# EasyEDA Pro project 省赛8通道电压.epro

# Schematic Schematic1

## Sheets
1 P1: Board Name: Board1; Create Date: 2025-04-08; Page Name: P1; Project Name: SCT2450_8CH; Schematic Name: Schematic1; Update Date: 2025-04-08; Company: 嘉立创EDA; Page Size: A4; Version: V1.0
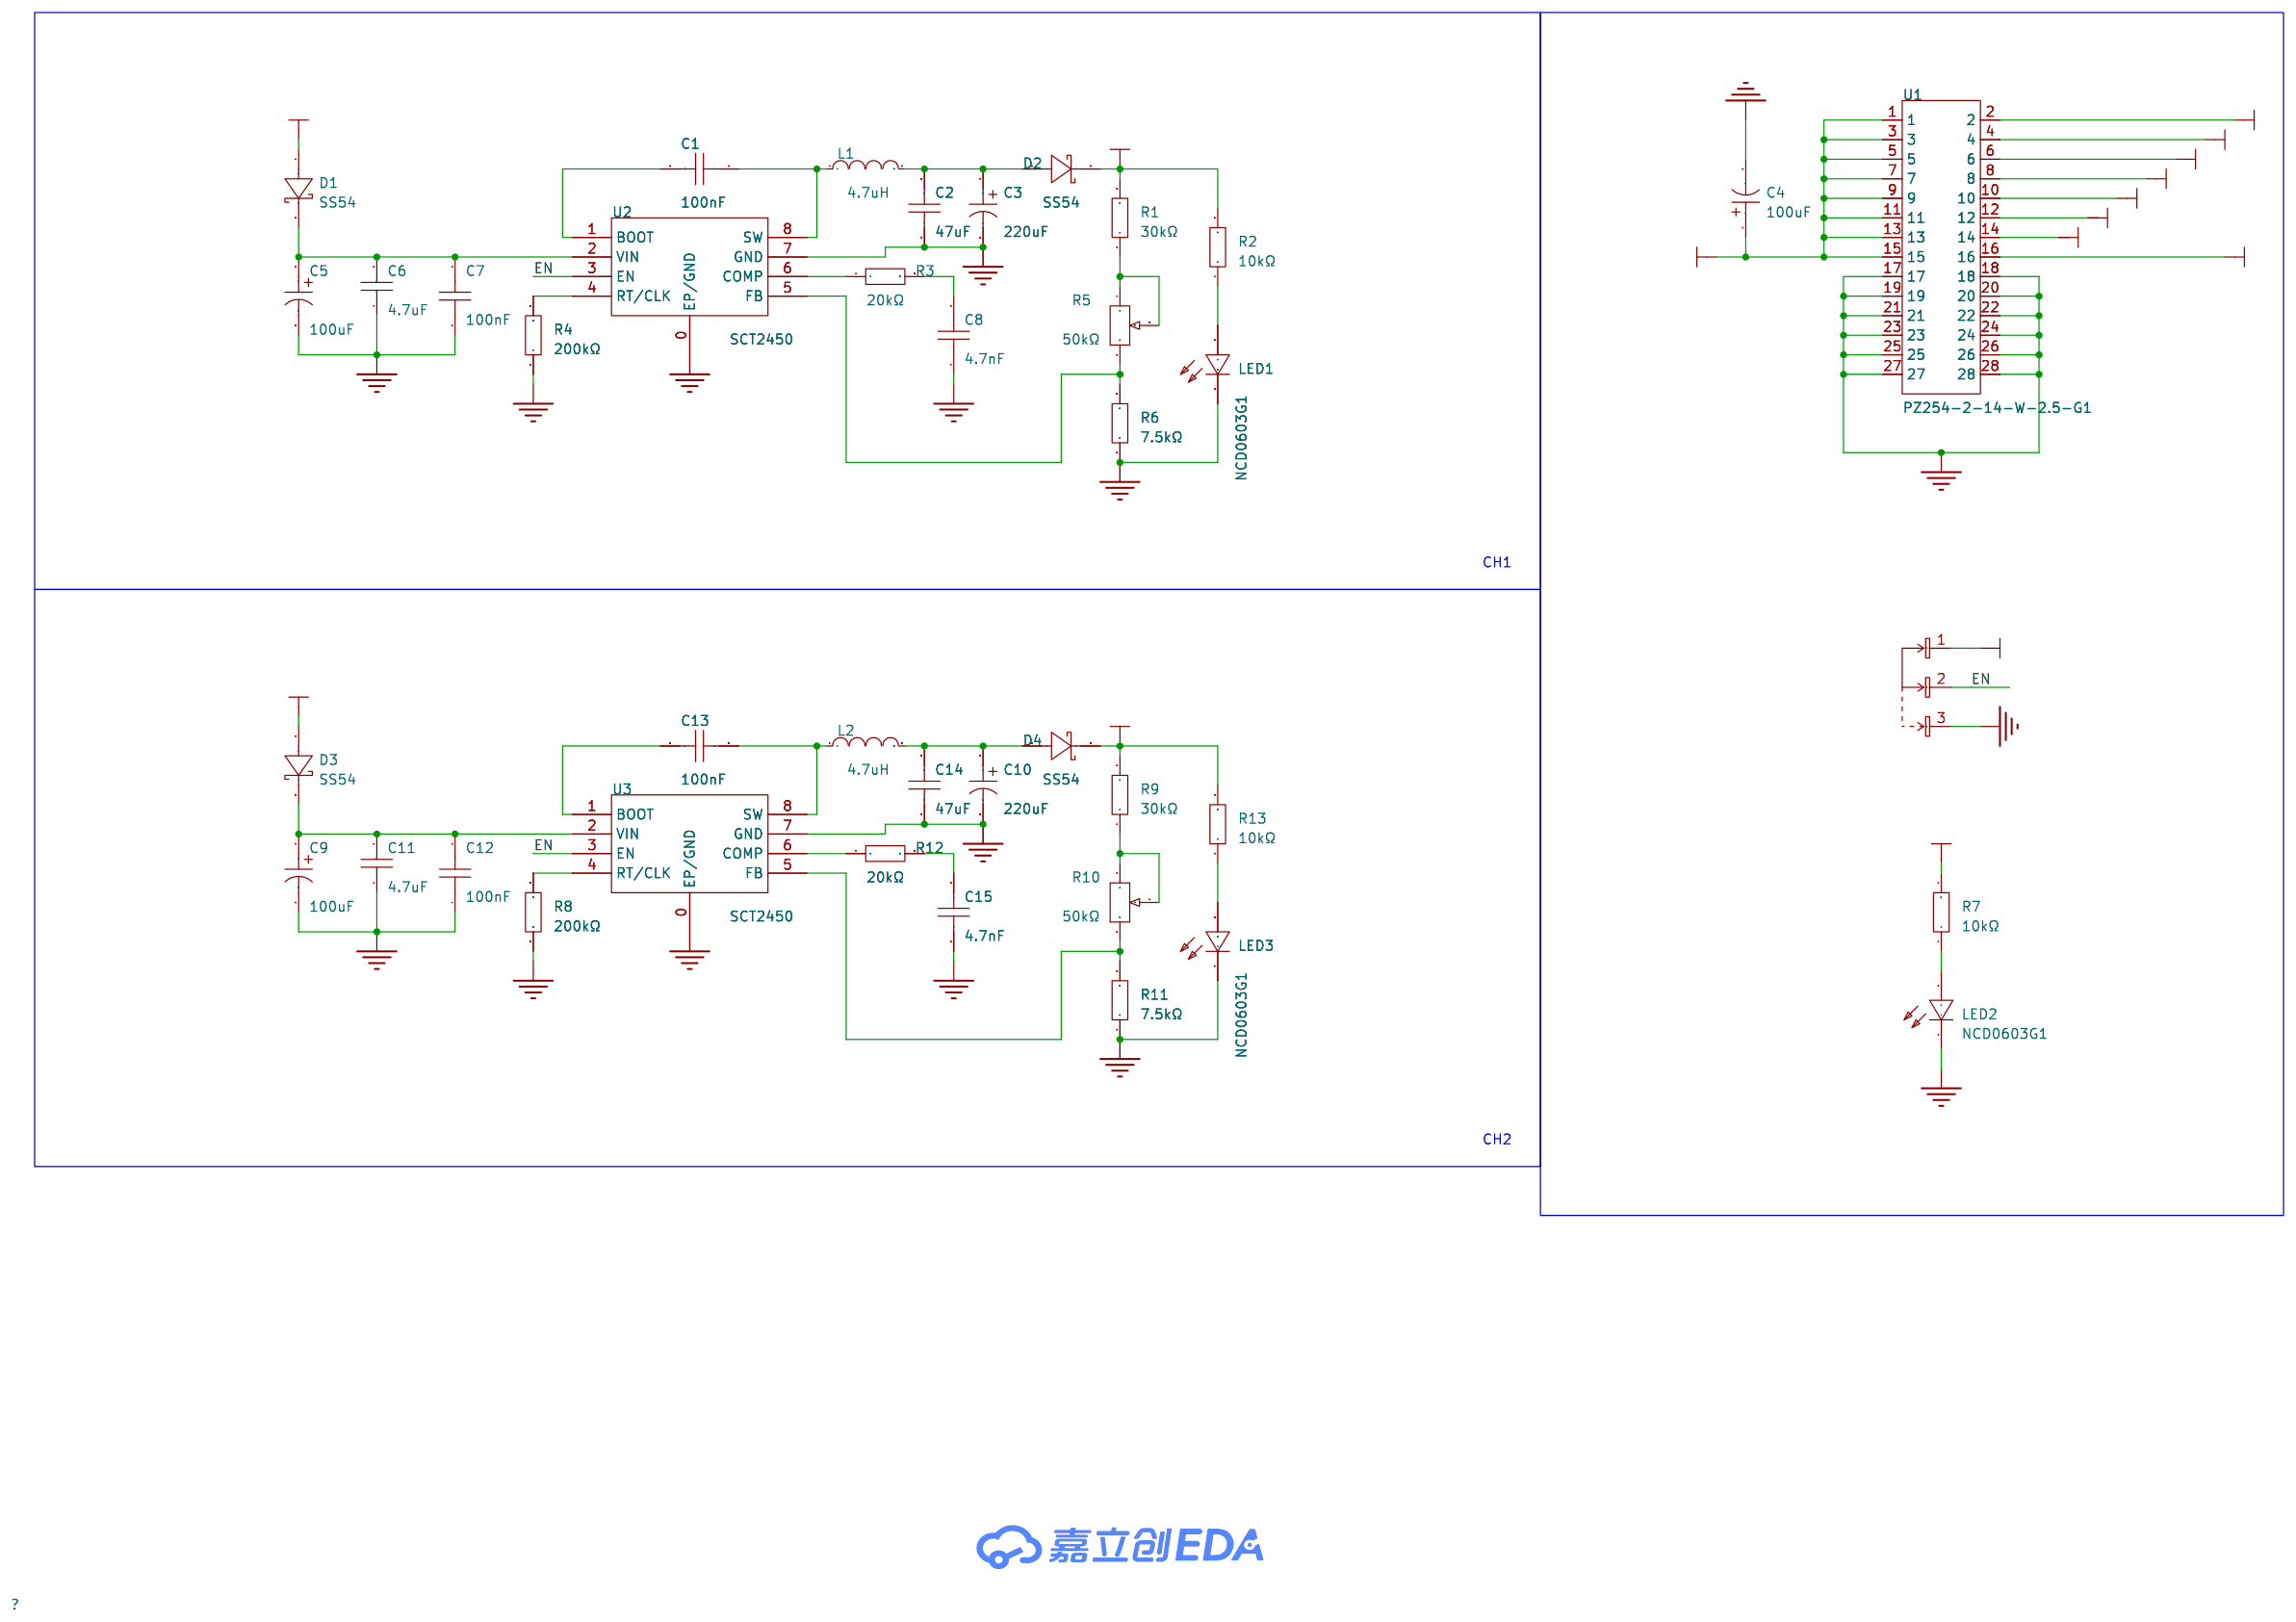
[diagram p0: P1]
2 P2: Page Name: P2
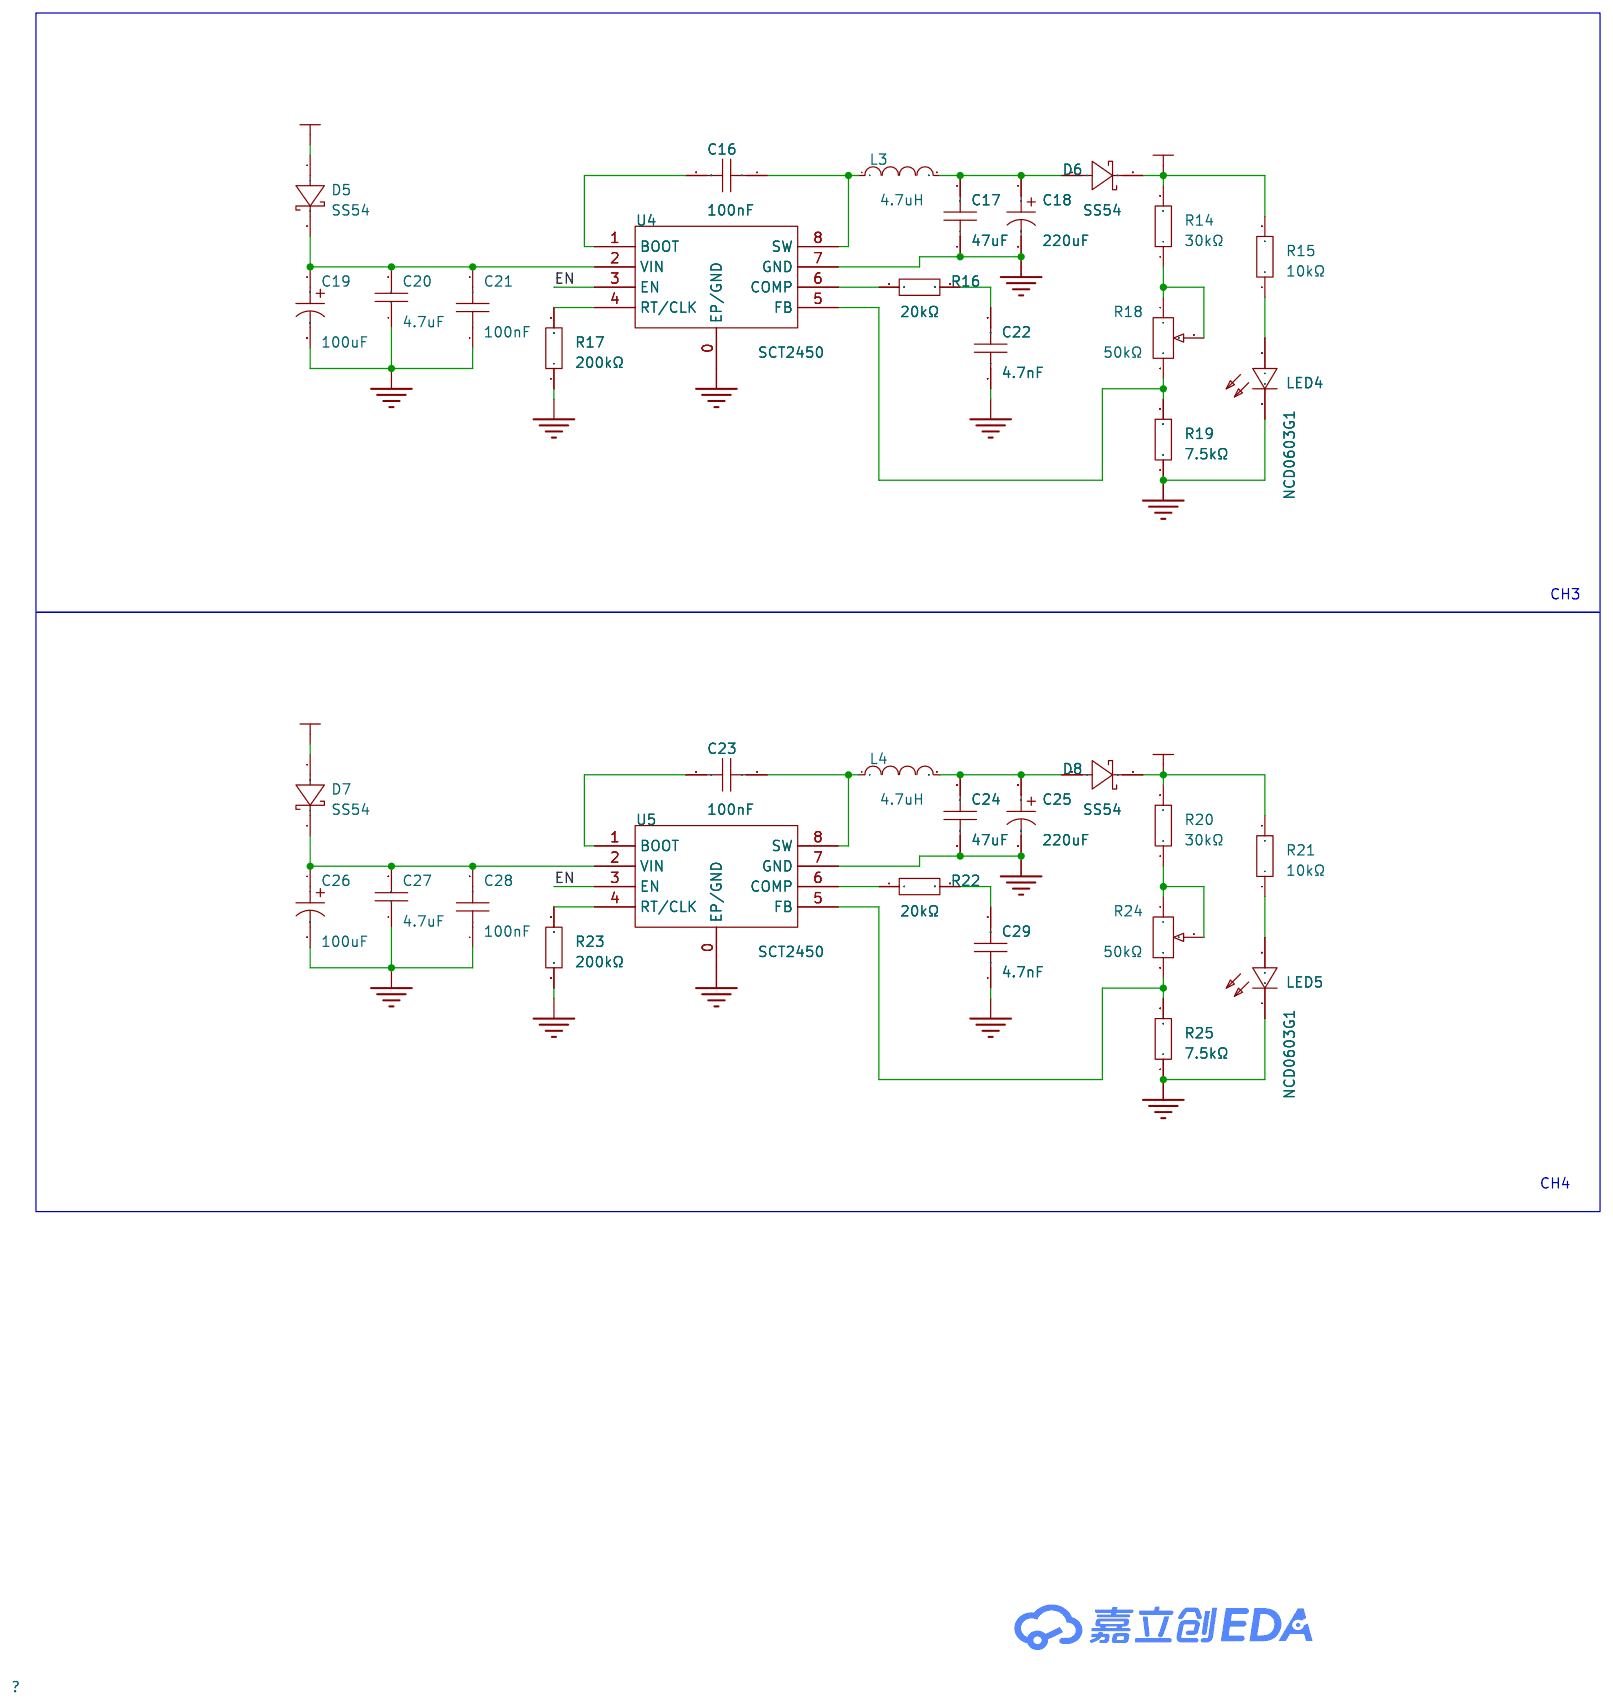
[diagram p1: P2]
3 P3: Page Name: P3
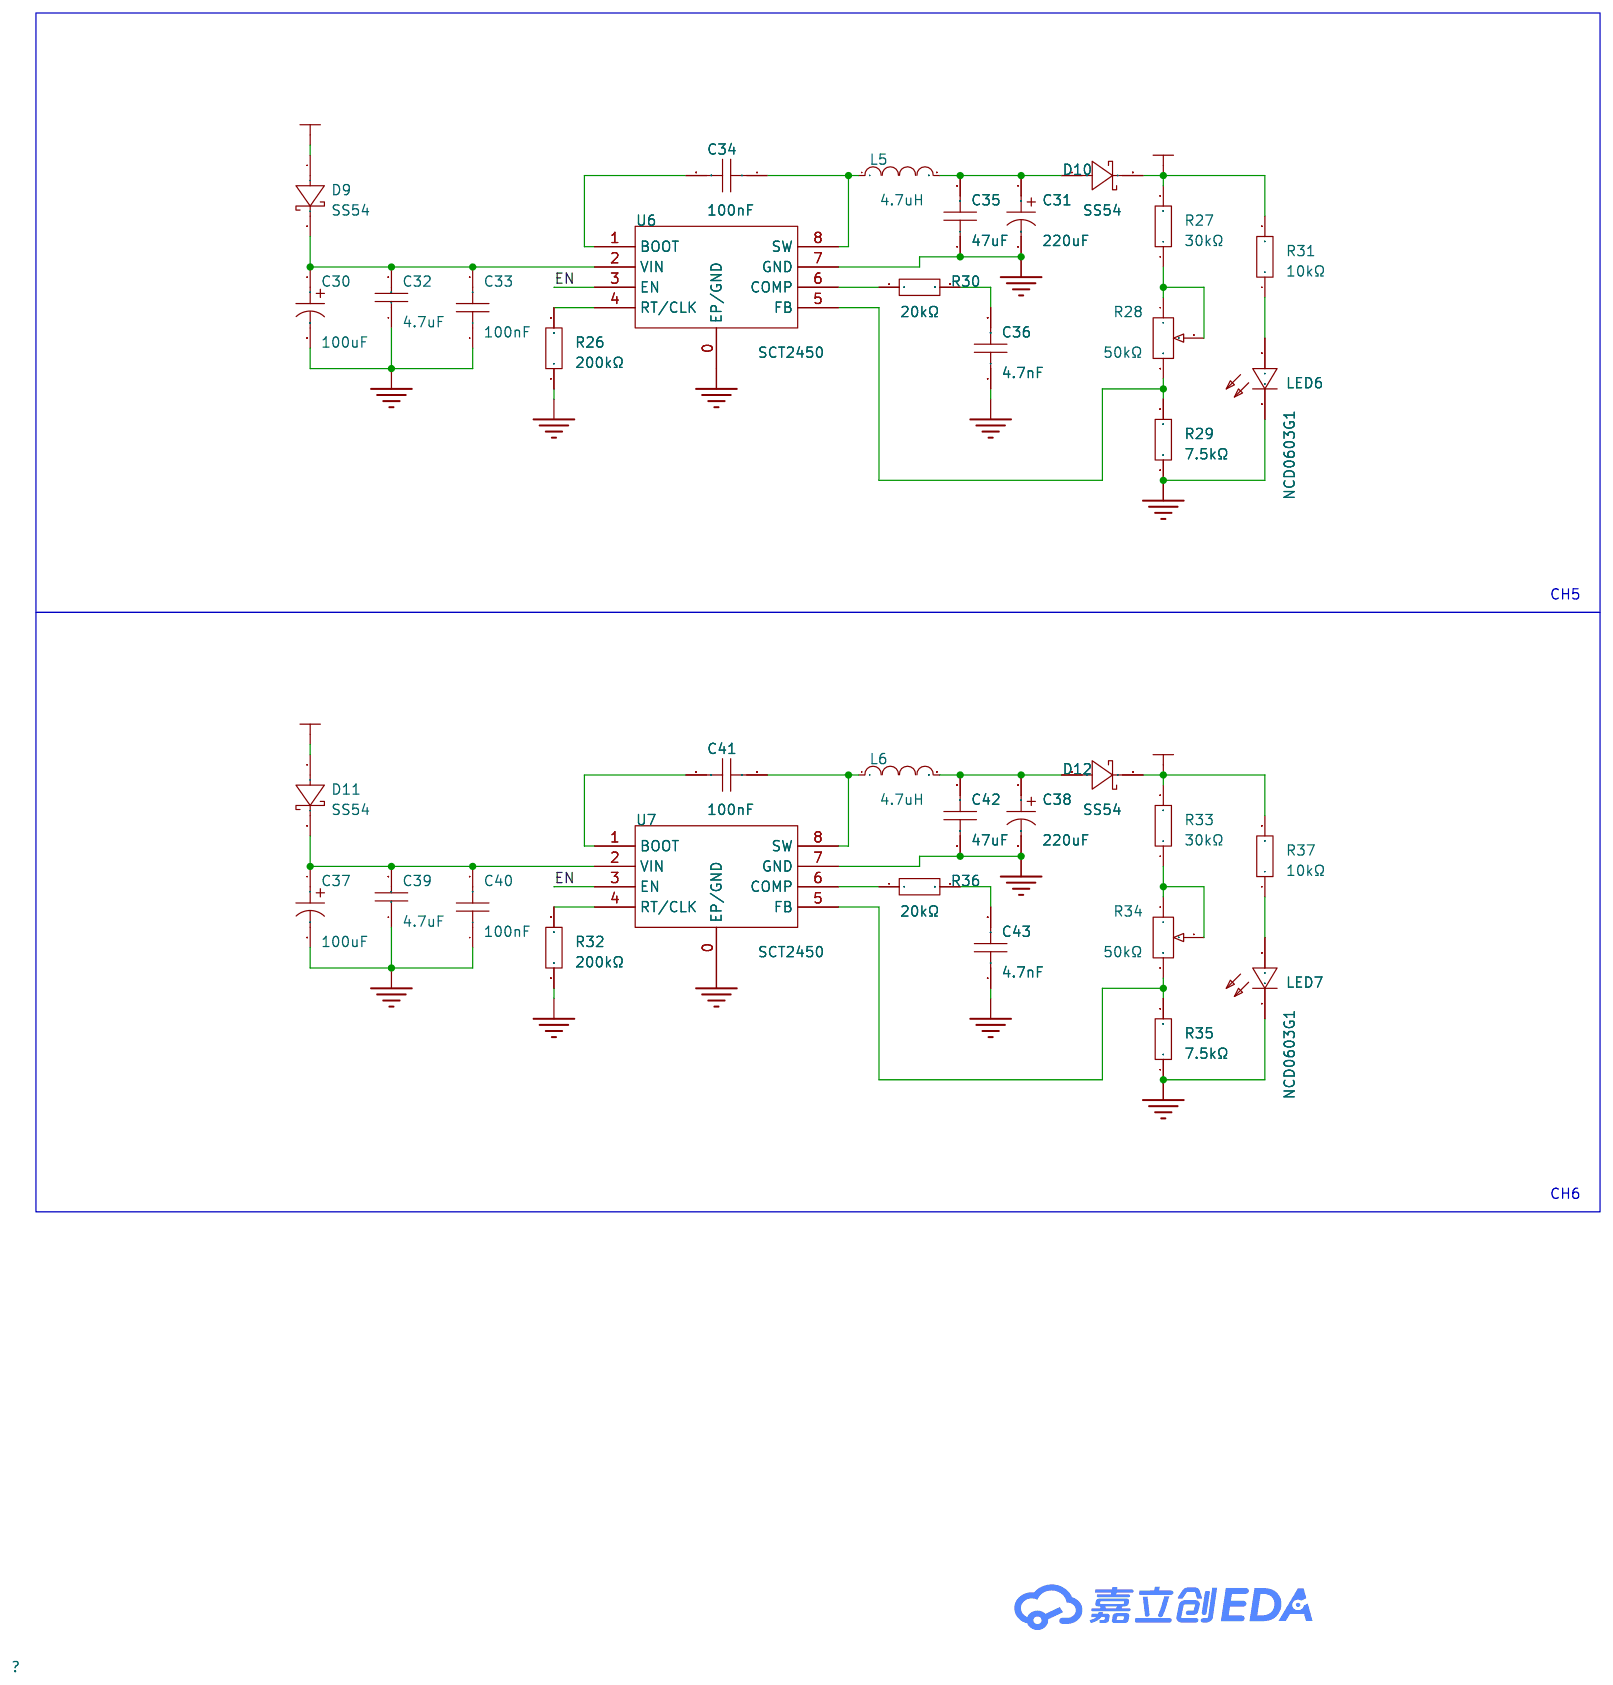
[diagram p2: P3]
4 P4: Page Name: P4
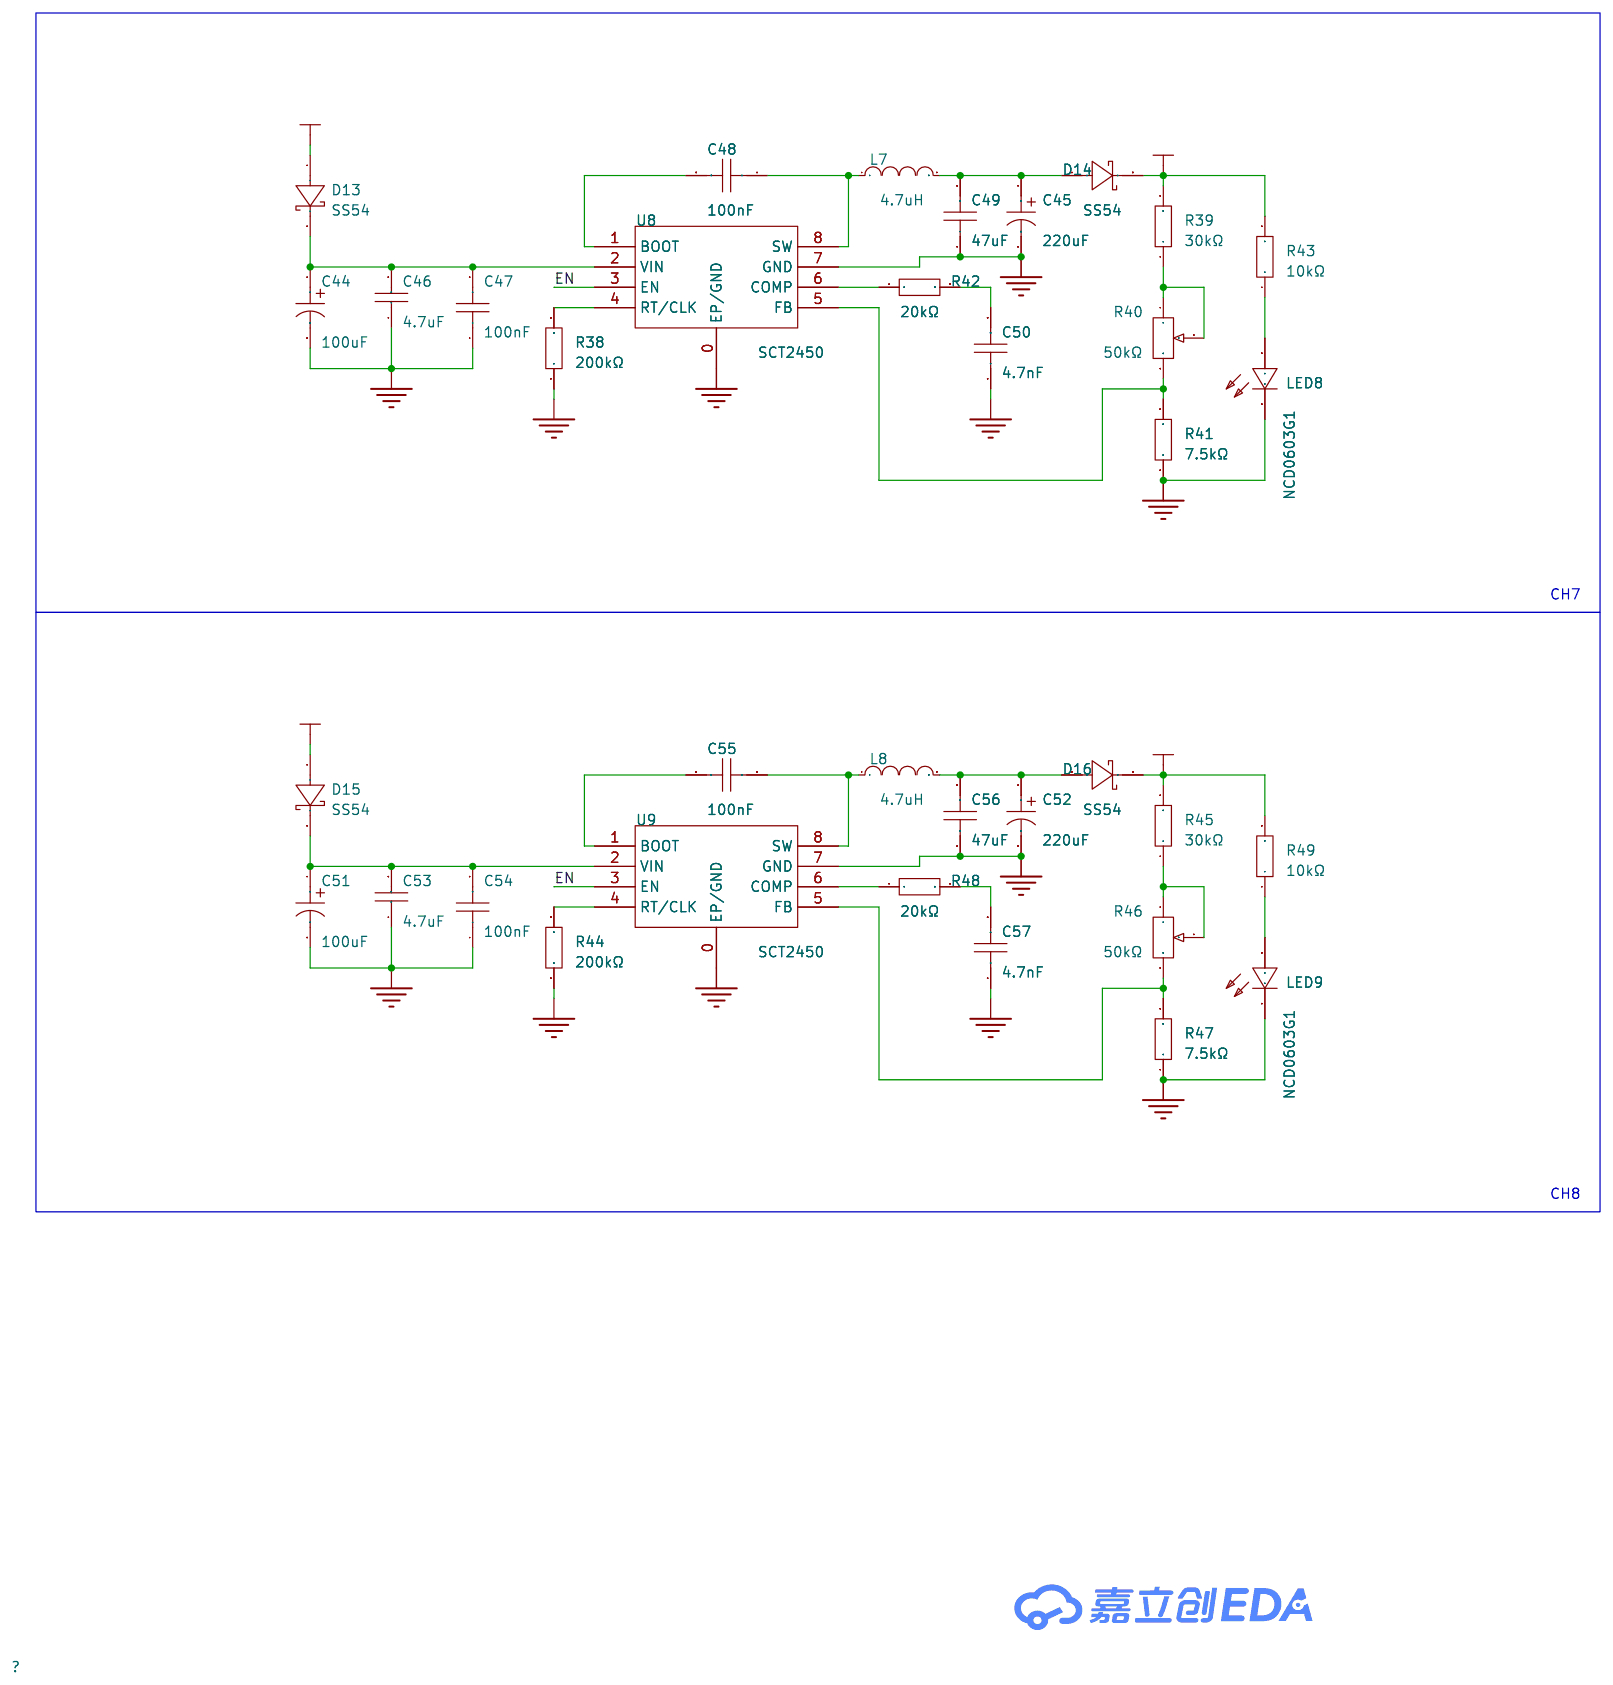
[diagram p3: P4]

## Parts
sheet P1
C1  100nF  [C0603]
C2  47uF  [C1206]
C3  220uF  [CAP-SMD_BD6.3-L6.6-W6.6-LS7.8-FD]
C4  100uF  [CAP-SMD_BD6.3-L6.6-W6.6-LS7.6-FD-1]
C5  100uF  [CAP-SMD_BD6.3-L6.6-W6.6-LS7.6-FD-1]
C6  4.7uF  [C1206]
C7  100nF  [C0603]
C8  4.7nF  [C0603]
C9  100uF  [CAP-SMD_BD6.3-L6.6-W6.6-LS7.6-FD-1]
C10  220uF  [CAP-SMD_BD6.3-L6.6-W6.6-LS7.8-FD]
C11  4.7uF  [C1206]
C12  100nF  [C0603]
C13  100nF  [C0603]
C14  47uF  [C1206]
C15  4.7nF  [C0603]
D1  SS54  [SMA_L4.3-W2.6-LS5.0-FD]
D2  SS54  [SMA_L4.3-W2.6-LS5.0-FD]
D3  SS54  [SMA_L4.3-W2.6-LS5.0-FD]
D4  SS54  [SMA_L4.3-W2.6-LS5.0-FD]
L1  4.7uH  [IND-SMD_L7.0-W6.6]
L2  4.7uH  [IND-SMD_L7.0-W6.6]
LED1  NCD0603G1  [LED0603-RD_1]
LED2  NCD0603G1  [LED0603-RD_1]
LED3  NCD0603G1  [LED0603-RD_1]
R1  30kΩ  [R0603]
R2  10kΩ  [R0603]
R3  20kΩ  [R0603]
R4  200kΩ  [R0603]
R5  50kΩ  [RES-ADJ-TH_3P-L7.1-W6.9-P2.50-L_3362P]
R6  7.5kΩ  [R0603]
R7  10kΩ  [R0603]
R8  200kΩ  [R0603]
R9  30kΩ  [R0603]
R10  50kΩ  [RES-ADJ-TH_3P-L7.1-W6.9-P2.50-L_3362P]
R11  7.5kΩ  [R0603]
R12  20kΩ  [R0603]
R13  10kΩ  [R0603]
SW1  SS-12D06L5  [SW-TH_3P-P4.70_L11.1-W12.7]
U1  PZ254-2-14-W-2.5-G1  [HDR-TH_28P-P2.54-H-M-R2-C14-S2.54]
U2  STC2450  [SOP-8E]
U3  STC2450  [SOP-8E]
sheet P2
C16  100nF  [C0603]
C17  47uF  [C1206]
C18  220uF  [CAP-SMD_BD6.3-L6.6-W6.6-LS7.8-FD]
C19  100uF  [CAP-SMD_BD6.3-L6.6-W6.6-LS7.6-FD-1]
C20  4.7uF  [C1206]
C21  100nF  [C0603]
C22  4.7nF  [C0603]
C23  100nF  [C0603]
C24  47uF  [C1206]
C25  220uF  [CAP-SMD_BD6.3-L6.6-W6.6-LS7.8-FD]
C26  100uF  [CAP-SMD_BD6.3-L6.6-W6.6-LS7.6-FD-1]
C27  4.7uF  [C1206]
C28  100nF  [C0603]
C29  4.7nF  [C0603]
D5  SS54  [SMA_L4.3-W2.6-LS5.0-FD]
D6  SS54  [SMA_L4.3-W2.6-LS5.0-FD]
D7  SS54  [SMA_L4.3-W2.6-LS5.0-FD]
D8  SS54  [SMA_L4.3-W2.6-LS5.0-FD]
L3  4.7uH  [IND-SMD_L7.0-W6.6]
L4  4.7uH  [IND-SMD_L7.0-W6.6]
LED4  NCD0603G1  [LED0603-RD_1]
LED5  NCD0603G1  [LED0603-RD_1]
R14  30kΩ  [R0603]
R15  10kΩ  [R0603]
R16  20kΩ  [R0603]
R17  200kΩ  [R0603]
R18  50kΩ  [RES-ADJ-TH_3P-L7.1-W6.9-P2.50-L_3362P]
R19  7.5kΩ  [R0603]
R20  30kΩ  [R0603]
R21  10kΩ  [R0603]
R22  20kΩ  [R0603]
R23  200kΩ  [R0603]
R24  50kΩ  [RES-ADJ-TH_3P-L7.1-W6.9-P2.50-L_3362P]
R25  7.5kΩ  [R0603]
U4  STC2450  [SOP-8E]
U5  STC2450  [SOP-8E]
sheet P3
C30  100uF  [CAP-SMD_BD6.3-L6.6-W6.6-LS7.6-FD-1]
C31  220uF  [CAP-SMD_BD6.3-L6.6-W6.6-LS7.8-FD]
C32  4.7uF  [C1206]
C33  100nF  [C0603]
C34  100nF  [C0603]
C35  47uF  [C1206]
C36  4.7nF  [C0603]
C37  100uF  [CAP-SMD_BD6.3-L6.6-W6.6-LS7.6-FD-1]
C38  220uF  [CAP-SMD_BD6.3-L6.6-W6.6-LS7.8-FD]
C39  4.7uF  [C1206]
C40  100nF  [C0603]
C41  100nF  [C0603]
C42  47uF  [C1206]
C43  4.7nF  [C0603]
D9  SS54  [SMA_L4.3-W2.6-LS5.0-FD]
D10  SS54  [SMA_L4.3-W2.6-LS5.0-FD]
D11  SS54  [SMA_L4.3-W2.6-LS5.0-FD]
D12  SS54  [SMA_L4.3-W2.6-LS5.0-FD]
L5  4.7uH  [IND-SMD_L7.0-W6.6]
L6  4.7uH  [IND-SMD_L7.0-W6.6]
LED6  NCD0603G1  [LED0603-RD_1]
LED7  NCD0603G1  [LED0603-RD_1]
R26  200kΩ  [R0603]
R27  30kΩ  [R0603]
R28  50kΩ  [RES-ADJ-TH_3P-L7.1-W6.9-P2.50-L_3362P]
R29  7.5kΩ  [R0603]
R30  20kΩ  [R0603]
R31  10kΩ  [R0603]
R32  200kΩ  [R0603]
R33  30kΩ  [R0603]
R34  50kΩ  [RES-ADJ-TH_3P-L7.1-W6.9-P2.50-L_3362P]
R35  7.5kΩ  [R0603]
R36  20kΩ  [R0603]
R37  10kΩ  [R0603]
U6  STC2450  [SOP-8E]
U7  STC2450  [SOP-8E]
sheet P4
C44  100uF  [CAP-SMD_BD6.3-L6.6-W6.6-LS7.6-FD-1]
C45  220uF  [CAP-SMD_BD6.3-L6.6-W6.6-LS7.8-FD]
C46  4.7uF  [C1206]
C47  100nF  [C0603]
C48  100nF  [C0603]
C49  47uF  [C1206]
C50  4.7nF  [C0603]
C51  100uF  [CAP-SMD_BD6.3-L6.6-W6.6-LS7.6-FD-1]
C52  220uF  [CAP-SMD_BD6.3-L6.6-W6.6-LS7.8-FD]
C53  4.7uF  [C1206]
C54  100nF  [C0603]
C55  100nF  [C0603]
C56  47uF  [C1206]
C57  4.7nF  [C0603]
D13  SS54  [SMA_L4.3-W2.6-LS5.0-FD]
D14  SS54  [SMA_L4.3-W2.6-LS5.0-FD]
D15  SS54  [SMA_L4.3-W2.6-LS5.0-FD]
D16  SS54  [SMA_L4.3-W2.6-LS5.0-FD]
L7  4.7uH  [IND-SMD_L7.0-W6.6]
L8  4.7uH  [IND-SMD_L7.0-W6.6]
LED8  NCD0603G1  [LED0603-RD_1]
LED9  NCD0603G1  [LED0603-RD_1]
R38  200kΩ  [R0603]
R39  30kΩ  [R0603]
R40  50kΩ  [RES-ADJ-TH_3P-L7.1-W6.9-P2.50-L_3362P]
R41  7.5kΩ  [R0603]
R42  20kΩ  [R0603]
R43  10kΩ  [R0603]
R44  200kΩ  [R0603]
R45  30kΩ  [R0603]
R46  50kΩ  [RES-ADJ-TH_3P-L7.1-W6.9-P2.50-L_3362P]
R47  7.5kΩ  [R0603]
R48  20kΩ  [R0603]
R49  10kΩ  [R0603]
U8  STC2450  [SOP-8E]
U9  STC2450  [SOP-8E]

## Library data of the parts
C1 C7 C12 C13 C16 C21 C23 C28 C33 C34 C40 C41 C47 C48 C54 C55 = CGA0603X7R104K500JT: 容值:100nF;精度:±10%;额定电压:50V;材质(温度系数):X7R;; LCSC Part Name: 100nF ±10% 50V; Supplier Part: C6119867; Manufacturer: HRE(芯声); Supplier Footprint: 0603; JLCPCB Part Class: 扩展库; Supplier: LCSC; Tolerance: ±10%; Voltage Rated: 50V; Temperature Coefficient: X7R
C2 C14 C17 C24 C35 C42 C49 C56 = HGC1206R5476M250NSPJ: 容值:47uF;精度:±20%;额定电压:25V;材质(温度系数):X5R;; LCSC Part Name: 47uF ±20% 25V; Supplier Part: C22367835; Manufacturer: Chinocera(华瓷); Supplier Footprint: 1206; JLCPCB Part Class: 扩展库; Datasheet: https://atta.szlcsc.com/upload/public/pdf/source/20240326/E6CB0DC43BB858B74F4352229FABFDCA.pdf; Supplier: LCSC; Tolerance: ±20%; Voltage Rated: 25V; Temperature Coefficient: X5R
C3 C10 C18 C25 C31 C38 C45 C52 = GVT1E227M0608CNVC: 容值:220uF;精度:±20%;额定电压:25V;纹波电流:120mA@120Hz;; LCSC Part Name: 220uF ±20% 25V; Supplier Part: C2983317; Manufacturer: HRK(鸿瑞凯电子); Supplier Footprint: SMD,D6.3xL7.7mm; JLCPCB Part Class: 扩展库; Datasheet: https://atta.szlcsc.com/upload/public/pdf/source/20220321/A04A91A46495B899B204BF58325E1842.pdf; Supplier: LCSC; Tolerance: ±20%; Rated Voltage: 25V; Ripple Current: 120mA@120Hz; φD: 6.3mm; L: 8mm; Lifetime @ Temp: 2000hrs@105℃; Operating Temperature: -55℃~+105℃
C4 C5 C9 C19 C26 C30 C37 C44 C51 = RVE100UF35V67RV0072: 容值:100uF;精度:±20%;额定电压:35V;纹波电流:230mA@120Hz;等效串联电阻:600mΩ@100kHz;; LCSC Part Name: 100uF ±20% 35V; Supplier Part: C2836437; Manufacturer: KNSCHA(科尼盛); Supplier Footprint: SMD,D6.3xL7.7mm; JLCPCB Part Class: 扩展库; Datasheet: https://atta.szlcsc.com/upload/public/pdf/source/20220719/B52EB46F8A1558448ED03D8B4CB3C24F.pdf; Supplier: LCSC; Tolerance: ±20%; Rated Voltage: 35V; Ripple Current: 230mA@120Hz; Equivalent Series Resistance(ESR): 600mΩ@100kHz; φD: 6.3mm; L: 7.7mm; Lifetime @ Temp: 2000hrs@105℃; Operating Temperature: -55℃~+105℃
C6 C11 C20 C27 C32 C39 C46 C53 = CL31B475KBHNNNE: 容值:4.7uF;精度:±10%;额定电压:50V;材质(温度系数):X7R;; LCSC Part Name: 4.7uF ±10% 50V; Supplier Part: C51205; Manufacturer: SAMSUNG(三星); Supplier Footprint: 1206; JLCPCB Part Class: 扩展库; Datasheet: https://atta.szlcsc.com/upload/public/pdf/source/20160218/1457707763339.pdf; Supplier: LCSC; Tolerance: ±10%; Voltage Rated: 50V; Temperature Coefficient: X7R
C8 C15 C22 C29 C36 C43 C50 C57 = CGA0603X7R472K500JT: 容值:4.7nF;精度:±10%;额定电压:50V;材质(温度系数):X7R;; LCSC Part Name: 4.7nF ±10% 50V; Supplier Part: C7503499; Manufacturer: HRE(芯声); Supplier Footprint: 0603; JLCPCB Part Class: 扩展库; Supplier: LCSC; Tolerance: ±10%; Voltage Rated: 50V; Temperature Coefficient: X7R
D1-D16 = SS54_C7420369: 二极管配置:独立式;正向压降(Vf):550mV@5.0A;直流反向耐压(Vr):40V;整流电流:5A;; LCSC Part Name: 电压:40V 电流:5A; Supplier Part: C7420369; Manufacturer: 宏迦橙; Supplier Footprint: SMA(DO-214AC); JLCPCB Part Class: 扩展库; Datasheet: https://atta.szlcsc.com/upload/public/pdf/source/20230828/254C3882F8647358AD9F60DD73611B5E.pdf; Supplier: LCSC; Diode Configuration: 独立式; Forward Voltage (Vf@If): 550mV@5.0A; Reverse Voltage (Vr): 40V; Rectified Current: 5A; Reverse Leakage Current (Ir): 50uA@40V
L1-L8 = FXL0630-4R7-M: 电感值:4.7uH;精度:±20%;额定电流:6A;饱和电流(Isat):9A;类型:一体成型电感;; LCSC Part Name: 4.7uH ±20% 9A; Supplier Part: C167220; Manufacturer: cjiang(长江微电); Supplier Footprint: SMD,6.6x7mm; JLCPCB Part Class: 扩展库; Datasheet: https://atta.szlcsc.com/upload/public/pdf/source/20240426/3189EA8206330E2108542F9E34E540E7.pdf; Supplier: LCSC; Tolerance: ±20%; Rated Current: 6A; Saturation Current (Isat): 9A; DC Resistance (DCR): 33mΩ; Type: 一体成型电感
LED1-LED9 = NCD0603G1: 发光颜色:翠绿色;正向电压(VF):2.6V~3.6V;功率:72mW;正向电流:10mA;主波长:515nm~530nm;透镜颜色:无色透明透镜;发光强度:330mcd~900mcd;发光角度:130°;工作温度:-30℃~+85℃;; Supplier Part: C84267; Manufacturer: 国星光电; Supplier Footprint: 0603; JLCPCB Part Class: 扩展库; Datasheet: https://atta.szlcsc.com/upload/public/pdf/source/20200820/C84267_04BA7703640BAC111D09F5EFB971FBF3.pdf; Supplier: LCSC; Emitted Color: 翠绿色; Forward Voltage (VF): 2.6V~3.6V; Power Dissipation: 72mW; Forward Current: 10mA; Dominant Wavelength: 515nm~530nm; Lens Color: 无色透明透镜; Luminous Intensity: 330mcd~900mcd; Viewing Angle: 130°; Operating Temperature: -30℃~+85℃
R1 R9 R14 R20 R27 R33 R39 R45 = 0603WAF3002T5E: 电阻类型:厚膜电阻;阻值:30kΩ;精度:±1%;功率:100mW;最大工作电压:75V;温度系数:±100ppm/℃;; LCSC Part Name: 30kΩ ±1% 100mW 厚膜电阻; Supplier Part: C22984; Manufacturer: UNI-ROYAL(厚声); Supplier Footprint: 0603; JLCPCB Part Class: 基础库; Datasheet: https://atta.szlcsc.com/upload/public/pdf/source/20200306/C422600_1E6D84923E4A46A82E41ADD87F860B5C.pdf; Supplier: LCSC; Type: 厚膜电阻; Tolerance: ±1%; Power(Watts): 100mW; Overload Voltage (Max): 75V; Temperature Coefficient: ±100ppm/℃; Operating Temperature Range: -55℃~+155℃
R2 R7 R13 R15 R21 R31 R37 R43 R49 = 0603WAF1002T5E: 电阻类型:厚膜电阻;阻值:10kΩ;精度:±1%;功率:100mW;最大工作电压:75V;温度系数:±100ppm/℃;; LCSC Part Name: 厚膜电阻 10kΩ ±1% 100mW; Supplier Part: C25804; Manufacturer: UNI-ROYAL(厚声); Supplier Footprint: 0603; JLCPCB Part Class: 基础库; Datasheet: https://atta.szlcsc.com/upload/public/pdf/source/20200306/C422600_1E6D84923E4A46A82E41ADD87F860B5C.pdf; Supplier: LCSC; Type: 厚膜电阻; Tolerance: ±1%; Power(Watts): 100mW; Overload Voltage (Max): 75V; Temperature Coefficient: ±100ppm/℃; Operating Temperature Range: -55℃~+155℃
R3 R12 R16 R22 R30 R36 R42 R48 = 0603WAF2002T5E: 电阻类型:厚膜电阻;阻值:20kΩ;精度:±1%;功率:100mW;最大工作电压:75V;温度系数:±100ppm/℃;; LCSC Part Name: 20kΩ ±1% 100mW 厚膜电阻; Supplier Part: C4184; Manufacturer: UNI-ROYAL(厚声); Supplier Footprint: 0603; JLCPCB Part Class: 基础库; Datasheet: https://atta.szlcsc.com/upload/public/pdf/source/20200306/C422600_1E6D84923E4A46A82E41ADD87F860B5C.pdf; Supplier: LCSC; Type: 厚膜电阻; Tolerance: ±1%; Power(Watts): 100mW; Overload Voltage (Max): 75V; Temperature Coefficient: ±100ppm/℃; Operating Temperature Range: -55℃~+155℃
R4 R8 R17 R23 R26 R32 R38 R44 = 0603WAF2003T5E: 电阻类型:厚膜电阻;阻值:200kΩ;精度:±1%;功率:100mW;最大工作电压:75V;温度系数:±100ppm/℃;; LCSC Part Name: 200kΩ ±1% 100mW 厚膜电阻; Supplier Part: C25811; Manufacturer: UNI-ROYAL(厚声); Supplier Footprint: 0603; JLCPCB Part Class: 基础库; Datasheet: https://atta.szlcsc.com/upload/public/pdf/source/20200306/C422600_1E6D84923E4A46A82E41ADD87F860B5C.pdf; Supplier: LCSC; Type: 厚膜电阻; Tolerance: ±1%; Power(Watts): 100mW; Overload Voltage (Max): 75V; Temperature Coefficient: ±100ppm/℃; Operating Temperature Range: -55℃~+155℃
R5 R10 R18 R24 R28 R34 R40 R46 = 3362P-1-503: 阻值:50kΩ;精度:±10%;; LCSC Part Name: 50kΩ ±10%; Supplier Part: C118910; Manufacturer: BOCHEN(博晨); Supplier Footprint: 插件; JLCPCB Part Class: 扩展库; Datasheet: https://atta.szlcsc.com/upload/public/pdf/source/20171114/C118910_15106326554621117400.pdf; Supplier: LCSC; Tolerance: ±10%
R6 R11 R19 R25 R29 R35 R41 R47 = 0603WAF7501T5E: 电阻类型:厚膜电阻;阻值:7.5kΩ;精度:±1%;功率:100mW;最大工作电压:75V;温度系数:±100ppm/℃;; LCSC Part Name: 7.5kΩ ±1% 100mW 厚膜电阻; Supplier Part: C23234; Manufacturer: UNI-ROYAL(厚声); Supplier Footprint: 0603; JLCPCB Part Class: 基础库; Datasheet: https://atta.szlcsc.com/upload/public/pdf/source/20200306/C422600_1E6D84923E4A46A82E41ADD87F860B5C.pdf; Supplier: LCSC; Type: 厚膜电阻; Tolerance: ±1%; Power(Watts): 100mW; Overload Voltage (Max): 75V; Temperature Coefficient: ±100ppm/℃; Operating Temperature Range: -55℃~+155℃
SW1 = SS-12D06L5: 电路结构:单刀双掷;安装方式:侧插;开关颜色:黑色;额定电流(DC):3A;额定电压(DC):250V;额定电流(AC):3A;额定电压(AC):250V;机械寿命:1万次;; LCSC Part Name: 柄长5mm 卧插双档 滑动开关; Supplier Part: C319015; Manufacturer: XKB Connectivity(中国星坤); Supplier Footprint: 插件; JLCPCB Part Class: Extended Part; Datasheet: https://atta.szlcsc.com/upload/public/pdf/source/20211009/0D67854FD60FB1F6FE75130AD47C052C.pdf; Supplier: LCSC; Circuit: 单刀双掷; Actuator Style: 矩形柱状; Pin Style: PC引脚; Switch Length: 12.95mm; Switch Width: 6.6mm; Switch Height: 6.3mm; Mounting Style: 侧插; Actuator Color: 黑色; Current Rating (DC): 3A; Voltage Rating (DC): 250V; Current Rating (AC): 3A; Voltage Rating (AC): 250V; Mechanical Life: 1万次; Operating Temperature: -40℃~+85℃
U1 = PZ254-2-14-W-2.5-G1: 插针结构:2x14P;间距:2.54mm;行距:2.54mm;圆针/方针:方针;安装方式:弯插;排数:双排;总PIN位数:28P;额定电流:3A;配合针长度:6mm;塑高:2.5mm;端接针长度:-;工作温度:-40℃~+105℃;颜色:黑色;; LCSC Part Name: 2x14P 间距:2.54mm 方针 弯插; Supplier Part: C18198028; Manufacturer: HCTL(华灿天禄); Supplier Footprint: 弯插,P=2.54mm; JLCPCB Part Class: Extended Part; Datasheet: https://atta.szlcsc.com/upload/public/pdf/source/20230921/EDF240DE1BFF70AE12D0E8E86FBA5889.pdf; Supplier: LCSC; Pin Structure: 2x14P; Pitch: 2.54mm; Row Spacing: 2.54mm; Circluar Pins/Square Pins: 方针; Mounting Type: 弯插; Number of Rows: 双排; Number of Pins: 28P; Current Rating: 3A; Length of Mating Pin: 6mm; Insulation Height: 2.5mm; Operating Temperature: -40℃~+105℃; Color: 黑色
U2-U9 = STC2450: Revision: V1.0

## Nets
GND: C2.1 C3.2 C4.2 C5.2 C6.1 C7.1 C8.1 C9.2 C10.2 C11.1 C12.1 C14.1 C15.1 C17.1 C18.2 C19.2 C20.1 C21.1 C22.1 C24.1 C25.2 C26.2 C27.1 C28.1 C29.1 C30.2 C31.2 C32.1 C33.1 C35.1 C36.1 C37.2 C38.2 C39.1 C40.1 C42.1 C43.1 C44.2 C45.2 C46.1 C47.1 C49.1 C50.1 C51.2 C52.2 C53.1 C54.1 C56.1 C57.1 LED1.1(K) LED2.1(K) LED3.1(K) LED4.1(K) LED5.1(K) LED6.1(K) LED7.1(K) LED8.1(K) LED9.1(K) R4.1 R6.1 R8.1 R11.1 R17.1 R19.1 R23.1 R25.1 R26.1 R29.1 R32.1 R35.1 R38.1 R41.1 R44.1 R47.1 SW1.3 U1.17 U1.18 U1.19 U1.20 U1.21 U1.22 U1.23 U1.24 U1.25 U1.26 U1.27 U1.28 U2.0(EP/GND) U2.7(GND) U3.0(EP/GND) U3.7(GND) U4.0(EP/GND) U4.7(GND) U5.0(EP/GND) U5.7(GND) U6.0(EP/GND) U6.7(GND) U7.0(EP/GND) U7.7(GND) U8.0(EP/GND) U8.7(GND) U9.0(EP/GND) U9.7(GND)
VCCSREER1: D2.2(K) R1.2 R2.2 U1.2
VCCSREER2: D4.2(K) R9.2 R13.2 U1.4
VCCSREER3: D6.2(K) R14.2 R15.2 U1.6
VCCSREER4: D8.2(K) R20.2 R21.2 U1.8
VCCSREER5: D10.2(K) R27.2 R31.2 U1.10
VCCSREER6: D12.2(K) R33.2 R37.2 U1.12
VCCSREER7: D14.2(K) R39.2 R43.2 U1.14
VCCSREER8: D16.2(K) R45.2 R49.2 U1.16
VIN: C4.1 D1.1(A) D3.1(A) D5.1(A) D7.1(A) D9.1(A) D11.1(A) D13.1(A) D15.1(A) R7.2 SW1.1 U1.1 U1.3 U1.5 U1.7 U1.9 U1.11 U1.13 U1.15
EN: SW1.2 U2.3(EN) U3.3(EN) U4.3(EN) U5.3(EN) U6.3(EN) U7.3(EN) U8.3(EN) U9.3(EN)
$1N896: R5.3 R6.2 U2.5(FB)
$1N897: R1.1 R5.1 R5.2
$1N898: LED1.2(A) R2.1
$1N901: R3.1 U2.6(COMP)
$1N902: C2.2 C3.1 D2.1(A) L1.2
$1N904: C8.2 R3.2
$1N905: C5.1 C6.2 C7.2 D1.2(K) U2.2(VIN)
$1N910: R4.2 U2.4(RT/CLK)
$1N911: C1.1 L1.1 U2.8(SW)
$1N912: C1.2 U2.1(BOOT)
$1N2242: LED2.2(A) R7.1
$1N3603: C15.2 R12.2
$1N3604: C13.1 L2.1 U3.8(SW)
$1N3605: R10.3 R11.2 U3.5(FB)
$1N3610: C10.1 C14.2 D4.1(A) L2.2
$1N3611: R12.1 U3.6(COMP)
$1N3612: R9.1 R10.1 R10.2
$1N3613: LED3.2(A) R13.1
$1N3615: C9.1 C11.2 C12.2 D3.2(K) U3.2(VIN)
$1N3618: C13.2 U3.1(BOOT)
$1N3619: R8.2 U3.4(RT/CLK)
$2N826: R17.2 U4.4(RT/CLK)
$2N827: C19.1 C20.2 C21.2 D5.2(K) U4.2(VIN)
$2N830: C16.2 U4.1(BOOT)
$2N832: C17.2 C18.1 D6.1(A) L3.2
$2N834: R18.3 R19.2 U4.5(FB)
$2N835: R14.1 R18.1 R18.2
$2N836: LED4.2(A) R15.1
$2N838: R16.1 U4.6(COMP)
$2N840: C22.2 R16.2
$2N841: C16.1 L3.1 U4.8(SW)
$2N1616: R23.2 U5.4(RT/CLK)
$2N1617: C26.1 C27.2 C28.2 D7.2(K) U5.2(VIN)
$2N1620: C23.2 U5.1(BOOT)
$2N1622: C24.2 C25.1 D8.1(A) L4.2
$2N1624: R24.3 R25.2 U5.5(FB)
$2N1625: R20.1 R24.1 R24.2
$2N1626: LED5.2(A) R21.1
$2N1628: R22.1 U5.6(COMP)
$2N1630: C29.2 R22.2
$2N1631: C23.1 L4.1 U5.8(SW)
$3N826: R27.1 R28.1 R28.2
$3N827: R28.3 R29.2 U6.5(FB)
$3N828: LED6.2(A) R31.1
$3N829: C36.2 R30.2
$3N833: R26.2 U6.4(RT/CLK)
$3N838: C30.1 C32.2 C33.2 D9.2(K) U6.2(VIN)
$3N840: C31.1 C35.2 D10.1(A) L5.2
$3N841: C34.1 L5.1 U6.8(SW)
$3N842: R30.1 U6.6(COMP)
$3N844: C34.2 U6.1(BOOT)
$3N1616: R33.1 R34.1 R34.2
$3N1617: R34.3 R35.2 U7.5(FB)
$3N1618: LED7.2(A) R37.1
$3N1619: C43.2 R36.2
$3N1623: R32.2 U7.4(RT/CLK)
$3N1628: C37.1 C39.2 C40.2 D11.2(K) U7.2(VIN)
$3N1630: C38.1 C42.2 D12.1(A) L6.2
$3N1631: C41.1 L6.1 U7.8(SW)
$3N1632: R36.1 U7.6(COMP)
$3N1634: C41.2 U7.1(BOOT)
$4N826: R40.3 R41.2 U8.5(FB)
$4N827: C50.2 R42.2
$4N829: LED8.2(A) R43.1
$4N831: R39.1 R40.1 R40.2
$4N833: C45.1 C49.2 D14.1(A) L7.2
$4N834: R38.2 U8.4(RT/CLK)
$4N838: C44.1 C46.2 C47.2 D13.2(K) U8.2(VIN)
$4N839: C48.1 L7.1 U8.8(SW)
$4N840: C48.2 U8.1(BOOT)
$4N842: R42.1 U8.6(COMP)
$4N2395: R44.2 U9.4(RT/CLK)
$4N2397: R45.1 R46.1 R46.2
$4N2399: C52.1 C56.2 D16.1(A) L8.2
$4N2400: C57.2 R48.2
$4N2401: R46.3 R47.2 U9.5(FB)
$4N2402: LED9.2(A) R49.1
$4N2405: C55.1 L8.1 U9.8(SW)
$4N2408: C51.1 C53.2 C54.2 D15.2(K) U9.2(VIN)
$4N2410: C55.2 U9.1(BOOT)
$4N2413: R48.1 U9.6(COMP)

## Notes on the sheets
sheet 1
- CH1
- CH2
sheet 2
- CH3
- CH4
sheet 3
- CH5
- CH6
sheet 4
- CH7
- CH8

# Board PCB1
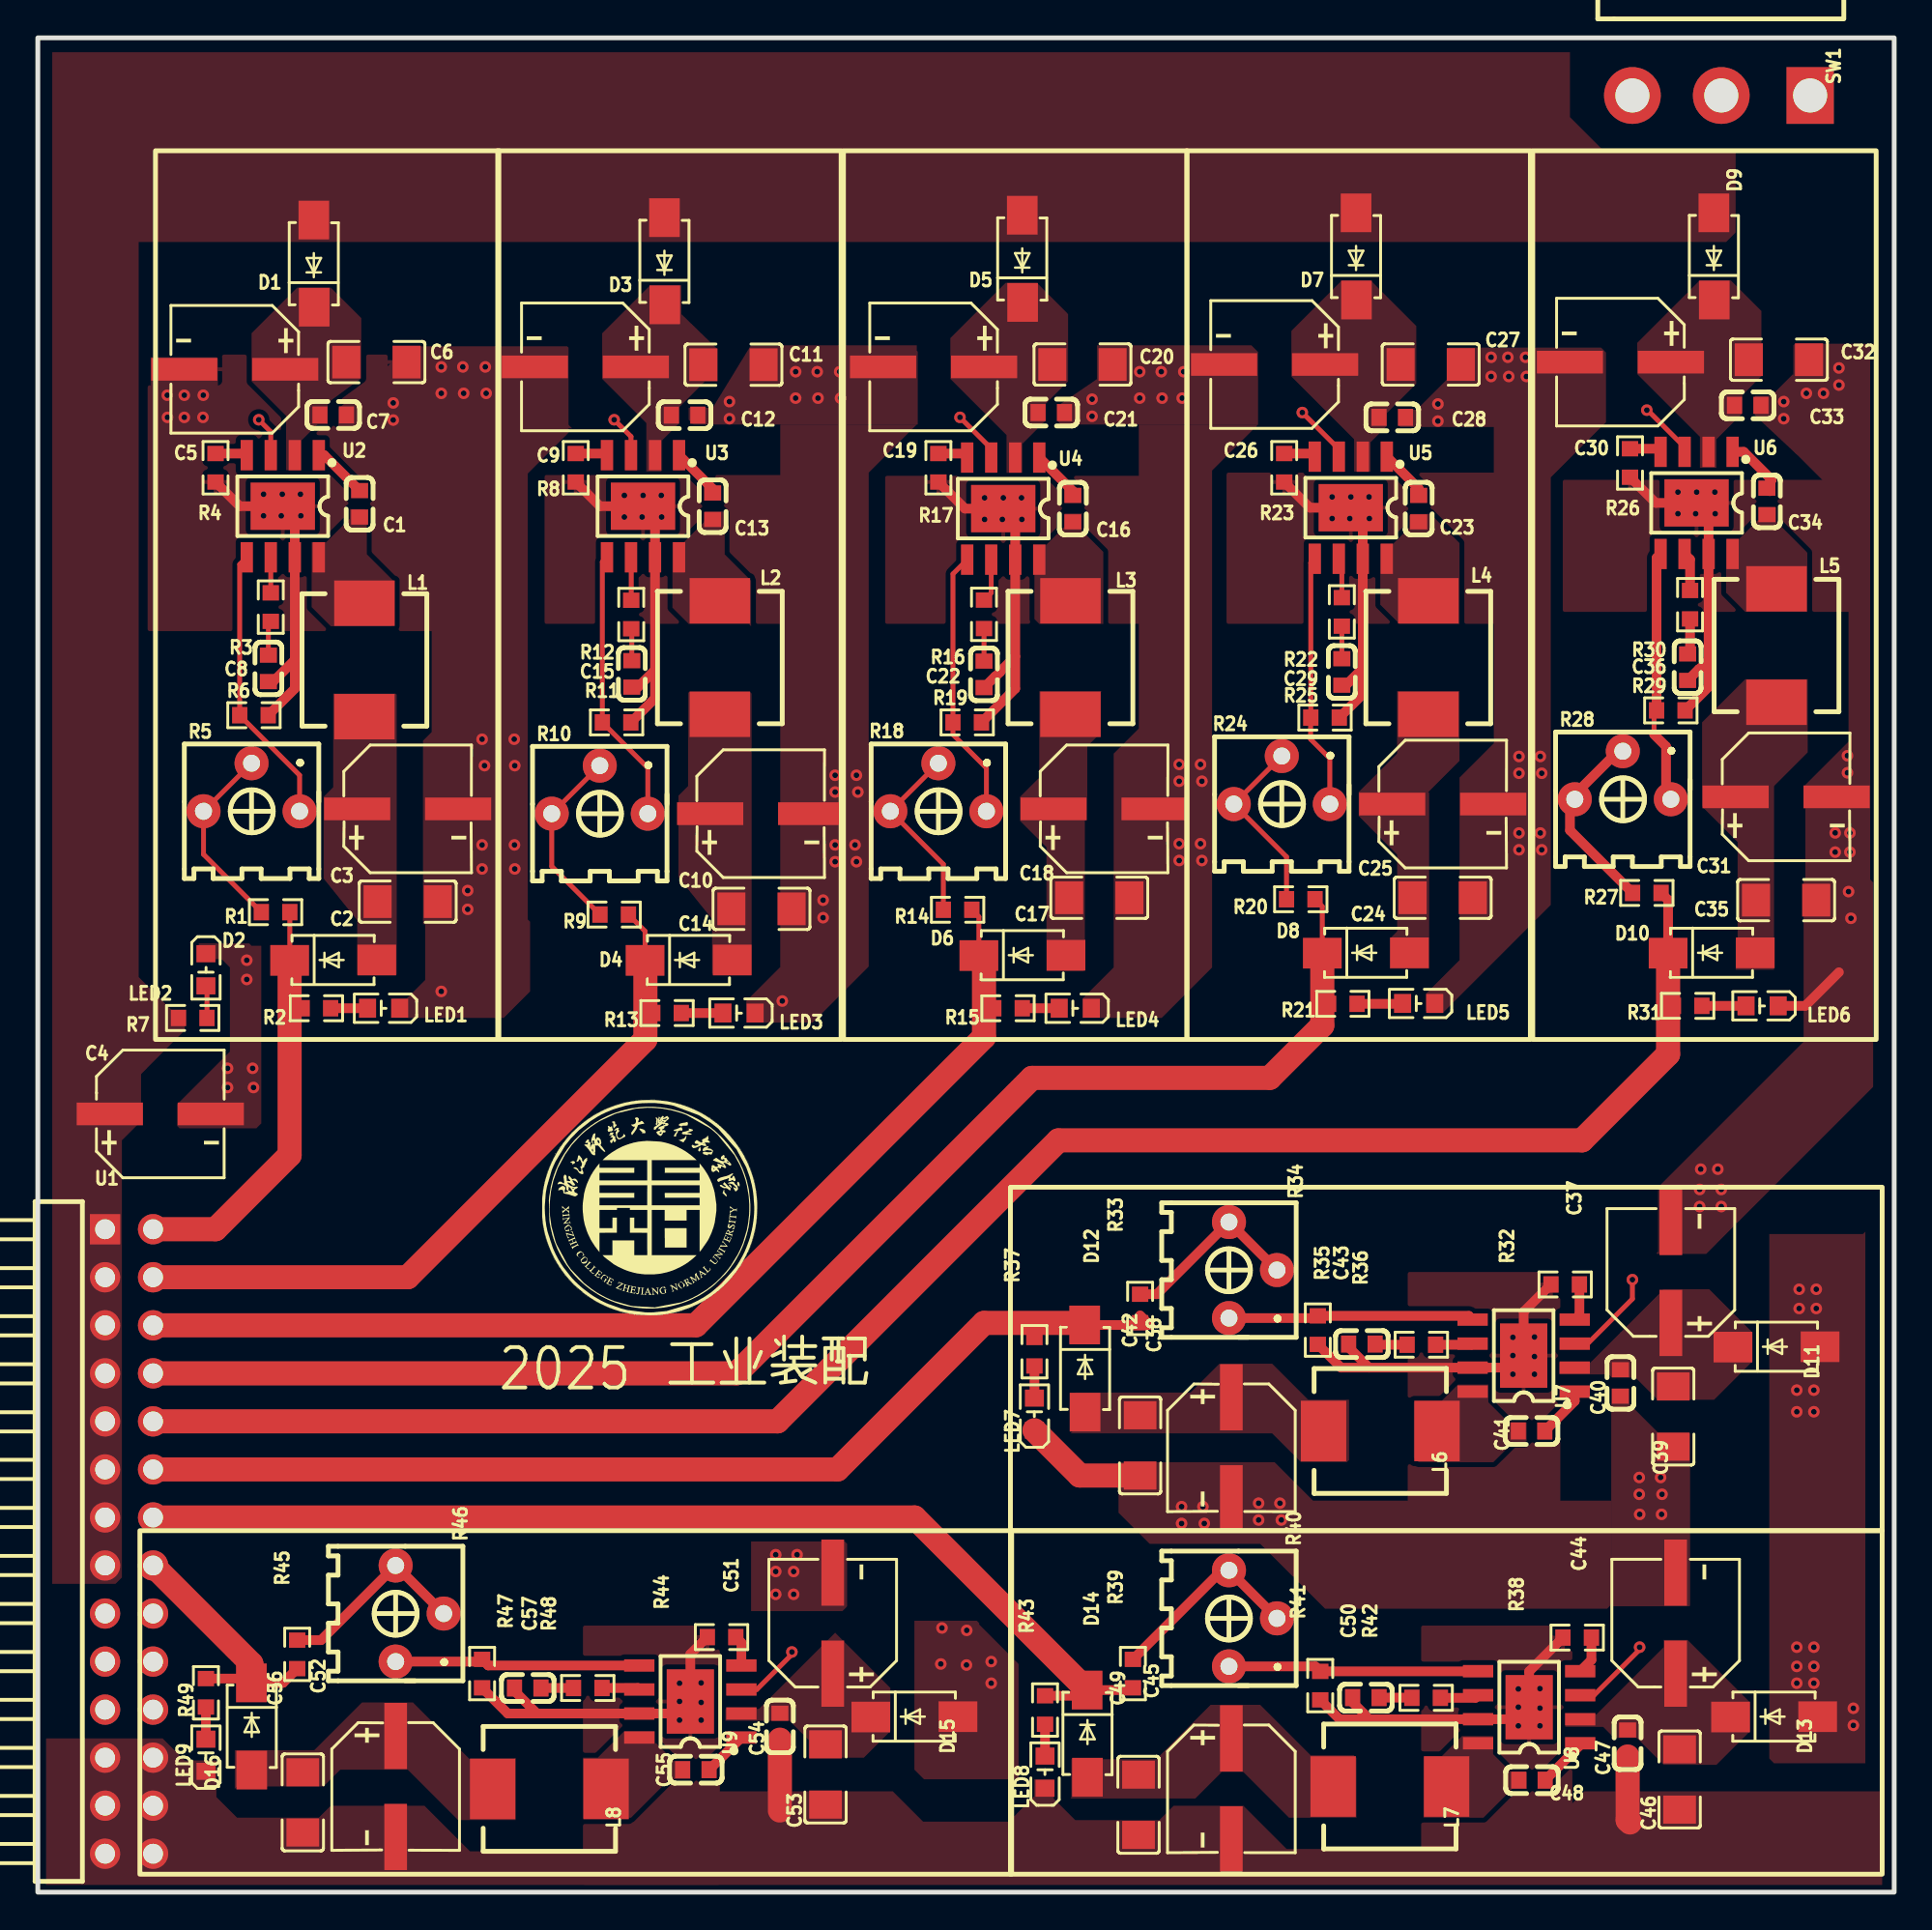
[diagram p4: board, top side]
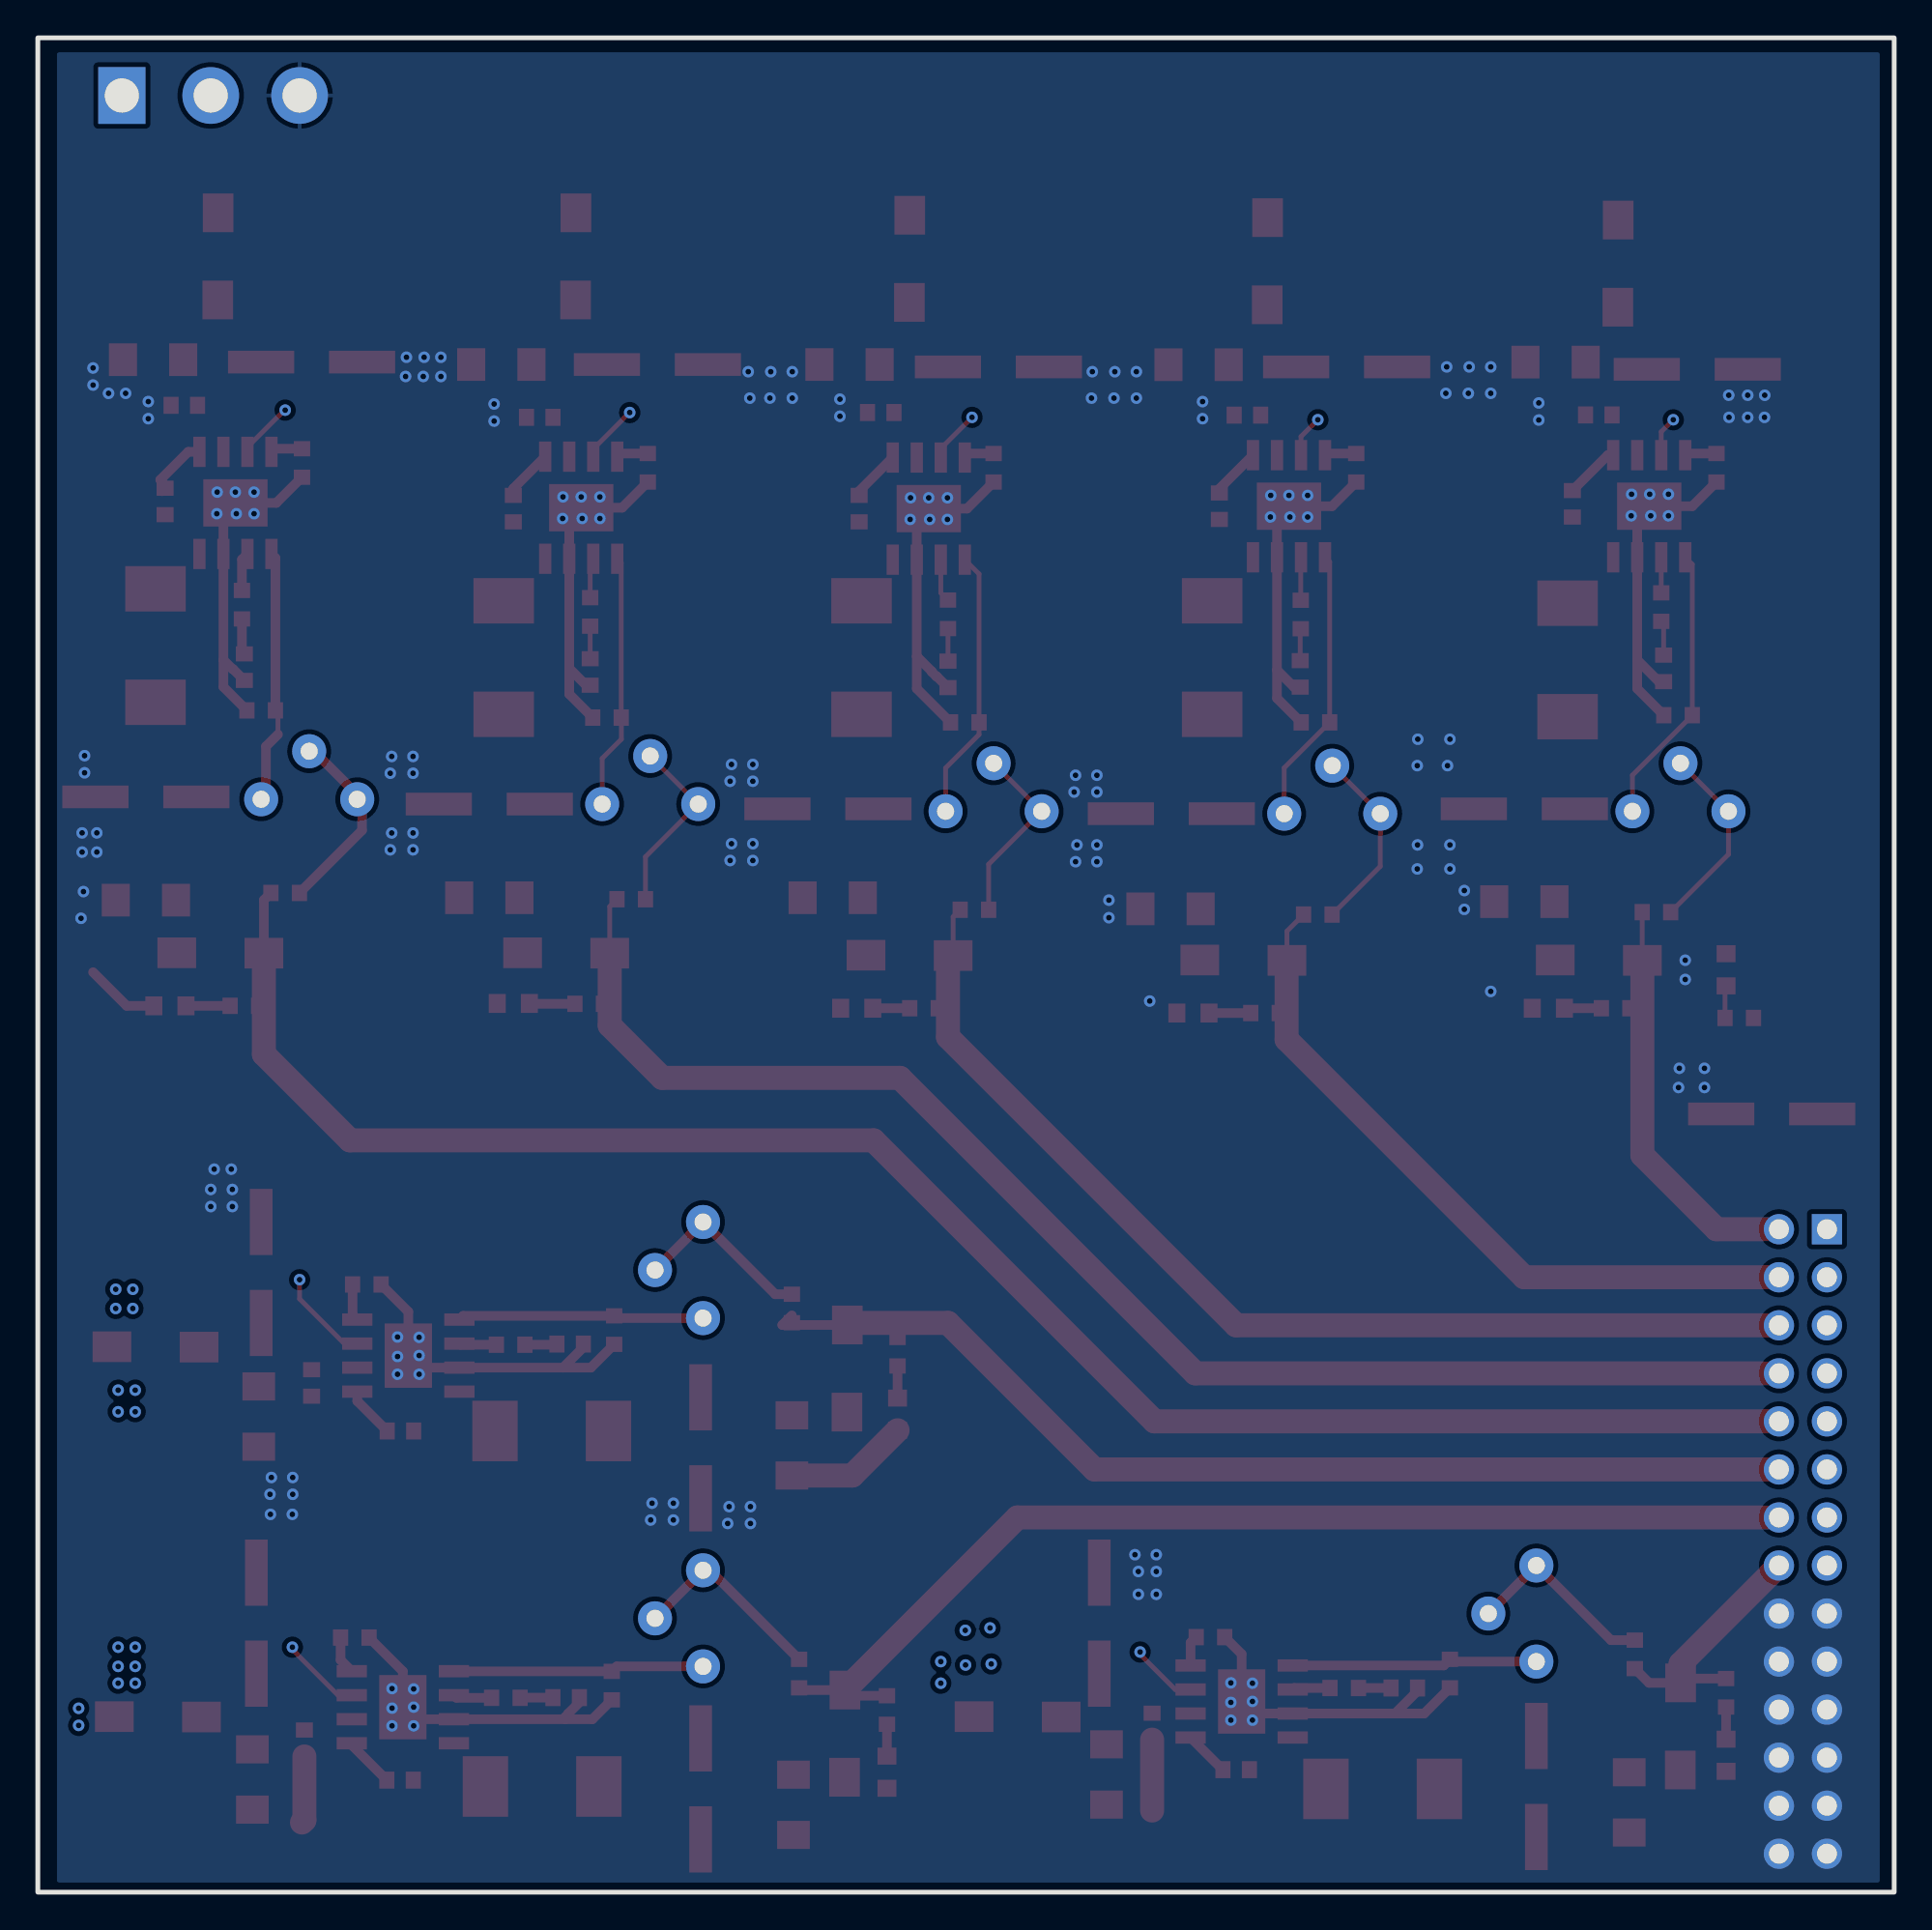
[diagram p5: board, bottom side, seen from below]

Outline 98.17 x 98.04 mm; copper layers: Top Layer, Inner1, Inner2, Bottom Layer. Coordinates in mm from the lower left corner of the outline.
Outline path: rectangle 0,98.04 98.17,0
Stack: Top Layer 0.035mm 外层铜厚1oz / Dielectric1 0.2104mm 7628 RC49% 8.6mil / Inner1 0.0152mm 内层铜厚 / Dielectric2 1.065mm 1.1mm H/HOZ Copper / Inner2 0.0152mm 内层铜厚 / Dielectric3 0.2104mm 7628 RC49% 8.6mil / Bottom Layer 0.035mm 外层铜厚1oz

## Design rules (mm)
template: JLCPCB Capability(Two Layers Board)
spacing copperThickness1oz (default): track to track 0.102, other pairs 0.152 to 0.3
spacing copperThickness2oz: track to track 0.203, other pairs 0.152 to 0.3
track width copperThickness1oz (default): min 0.127, default 0.254, max 2.54
track width copperThickness2oz: min 0.203, default 0.254, max 2.54
differential pair differentialPair (default): width min 0.127, default 0.254, max 2.54; gap min 0.152, default 0.152
via viaSize (default): diameter min 0.5, default 0.61, max 10; hole min 0.3, default 0.305, max 6.3

## Placement (name value [footprint] x y rotation side)
C1  100nF  [C0603]  17.02 73.41 90 top
C2  47uF  [C1206]  19.56 52.37 180 top
C3  220uF  [CAP-SMD_BD6.3-L6.6-W6.6-LS7.8-FD]  19.56 57.28 0 top
C4  100uF  [CAP-SMD_BD6.3-L6.6-W6.6-LS7.6-FD-1]  6.48 41.15 0 top
C5  100uF  [CAP-SMD_BD6.3-L6.6-W6.6-LS7.6-FD-1]  10.41 80.52 180 top
C6  4.7uF  [C1206]  17.91 80.9 180 top
C7  100nF  [C0603]  15.62 78.11 180 top
C8  4.7nF  [C0603]  12.19 64.71 90 top
C9  100uF  [CAP-SMD_BD6.3-L6.6-W6.6-LS7.6-FD-1]  28.96 80.64 180 top
C10  220uF  [CAP-SMD_BD6.3-L6.6-W6.6-LS7.8-FD]  38.23 57.02 0 top
C11  4.7uF  [C1206]  36.79 80.76 180 top
C12  100nF  [C0603]  34.2 78.09 180 top
C13  100nF  [C0603]  35.69 73.28 90 top
C14  47uF  [C1206]  38.27 51.99 180 top
C15  4.7nF  [C0603]  31.41 64.41 90 top
C16  100nF  [C0603]  54.74 73.15 90 top
C17  47uF  [C1206]  56.13 52.58 180 top
C18  220uF  [CAP-SMD_BD6.3-L6.6-W6.6-LS7.8-FD]  56.39 57.28 0 top
C19  100uF  [CAP-SMD_BD6.3-L6.6-W6.6-LS7.6-FD-1]  47.37 80.64 180 top
C20  4.7uF  [C1206]  55.24 80.77 180 top
C21  100nF  [C0603]  53.59 78.23 180 top
C22  4.7nF  [C0603]  50.04 64.39 90 top
C23  100nF  [C0603]  73.02 73.15 90 top
C24  47uF  [C1206]  74.3 52.58 180 top
C25  220uF  [CAP-SMD_BD6.3-L6.6-W6.6-LS7.8-FD]  74.3 57.53 0 top
C26  100uF  [CAP-SMD_BD6.3-L6.6-W6.6-LS7.6-FD-1]  65.4 80.77 180 top
C27  4.7uF  [C1206]  73.66 80.77 180 top
C28  100nF  [C0603]  71.63 77.98 180 top
C29  4.7nF  [C0603]  68.96 64.52 90 top
C30  100uF  [CAP-SMD_BD6.3-L6.6-W6.6-LS7.6-FD-1]  83.69 80.9 180 top
C31  220uF  [CAP-SMD_BD6.3-L6.6-W6.6-LS7.8-FD]  92.46 57.91 0 top
C32  4.7uF  [C1206]  92.08 81.03 180 top
C33  100nF  [C0603]  90.42 78.61 180 top
C34  100nF  [C0603]  91.44 73.53 90 top
C35  47uF  [C1206]  92.46 52.45 180 top
C36  4.7nF  [C0603]  87.25 64.77 90 top
C37  100uF  [CAP-SMD_BD6.3-L6.6-W6.6-LS7.6-FD-1]  86.36 32.77 90 top
C38  220uF  [CAP-SMD_BD6.3-L6.6-W6.6-LS7.8-FD]  63.12 23.5 270 top
C39  4.7uF  [C1206]  86.49 25.15 90 top
C40  100nF  [C0603]  83.69 26.92 90 top
C41  100nF  [C0603]  78.99 24.38 0 top
C42  47uF  [C1206]  58.29 23.62 90 top
C43  4.7nF  [C0603]  70.02 28.98 0 top
C44  100uF  [CAP-SMD_BD6.3-L6.6-W6.6-LS7.6-FD-1]  86.61 14.22 90 top
C45  220uF  [CAP-SMD_BD6.3-L6.6-W6.6-LS7.8-FD]  63.12 5.46 270 top
C46  4.7uF  [C1206]  86.82 5.96 90 top
C47  100nF  [C0603]  84.07 7.87 90 top
C48  100nF  [C0603]  79.01 5.92 0 top
C49  47uF  [C1206]  58.21 4.62 90 top
C50  4.7nF  [C0603]  70.23 10.29 0 top
C51  100uF  [CAP-SMD_BD6.3-L6.6-W6.6-LS7.6-FD-1]  42.04 14.22 90 top
C52  220uF  [CAP-SMD_BD6.3-L6.6-W6.6-LS7.8-FD]  18.92 5.59 270 top
C53  4.7uF  [C1206]  41.66 6.22 90 top
C54  100nF  [C0603]  39.24 8.76 90 top
C55  100nF  [C0603]  34.8 6.48 0 top
C56  47uF  [C1206]  14.01 4.75 90 top
C57  4.7nF  [C0603]  25.91 10.79 0 top
D1  SS54  [SMA_L4.3-W2.6-LS5.0-FD]  14.6 86.11 270 top
D2  SS54  [SMA_L4.3-W2.6-LS5.0-FD]  15.62 49.28 180 top
D3  SS54  [SMA_L4.3-W2.6-LS5.0-FD]  33.15 86.23 270 top
D4  SS54  [SMA_L4.3-W2.6-LS5.0-FD]  34.42 49.28 180 top
D5  SS54  [SMA_L4.3-W2.6-LS5.0-FD]  52.07 86.36 270 top
D6  SS54  [SMA_L4.3-W2.6-LS5.0-FD]  52.07 49.53 180 top
D7  SS54  [SMA_L4.3-W2.6-LS5.0-FD]  69.72 86.49 270 top
D8  SS54  [SMA_L4.3-W2.6-LS5.0-FD]  70.23 49.66 180 top
D9  SS54  [SMA_L4.3-W2.6-LS5.0-FD]  88.65 86.49 270 top
D10  SS54  [SMA_L4.3-W2.6-LS5.0-FD]  88.52 49.66 180 top
D11  SS54  [SMA_L4.3-W2.6-LS5.0-FD]  91.95 28.83 180 top
D12  SS54  [SMA_L4.3-W2.6-LS5.0-FD]  55.37 27.69 90 top
D13  SS54  [SMA_L4.3-W2.6-LS5.0-FD]  91.82 9.27 180 top
D14  SS54  [SMA_L4.3-W2.6-LS5.0-FD]  55.5 8.38 90 top
D15  SS54  [SMA_L4.3-W2.6-LS5.0-FD]  46.36 9.27 180 top
D16  SS54  [SMA_L4.3-W2.6-LS5.0-FD]  11.3 8.76 90 top
L1  4.7uH  [IND-SMD_L7.0-W6.6]  17.27 65.15 270 top
L2  4.7uH  [IND-SMD_L7.0-W6.6]  36.07 65.28 270 top
L3  4.7uH  [IND-SMD_L7.0-W6.6]  54.61 65.28 270 top
L4  4.7uH  [IND-SMD_L7.0-W6.6]  73.53 65.28 270 top
L5  4.7uH  [IND-SMD_L7.0-W6.6]  91.95 65.91 270 top
L6  4.7uH  [IND-SMD_L7.0-W6.6]  70.99 24.38 180 top
L7  4.7uH  [IND-SMD_L7.0-W6.6]  71.5 5.59 180 top
L8  4.7uH  [IND-SMD_L7.0-W6.6]  27.05 5.46 180 top
LED1  NCD0603G1  [LED0603-RD_1]  18.29 46.74 180 top
LED2  NCD0603G1  [LED0603-RD_1]  8.89 48.77 270 top
LED3  NCD0603G1  [LED0603-RD_1]  37.08 46.48 180 top
LED4  NCD0603G1  [LED0603-RD_1]  54.86 46.74 180 top
LED5  NCD0603G1  [LED0603-RD_1]  73.02 46.99 180 top
LED6  NCD0603G1  [LED0603-RD_1]  91.19 46.86 180 top
LED7  NCD0603G1  [LED0603-RD_1]  52.7 25.27 90 top
LED8  NCD0603G1  [LED0603-RD_1]  53.27 6.34 90 top
LED9  NCD0603G1  [LED0603-RD_1]  8.89 7.24 90 top
R1  30kΩ  [R0603]  12.57 51.82 0 top
R2  10kΩ  [R0603]  14.73 46.74 180 top
R3  20kΩ  [R0603]  12.32 67.94 270 top
R4  200kΩ  [R0603]  9.4 75.31 90 top
R5  50kΩ  [RES-ADJ-TH_3P-L7.1-W6.9-P2.50-L_3362P]  11.3 58.42 0 top
R6  7.5kΩ  [R0603]  11.43 62.23 180 top
R7  10kΩ  [R0603]  8.19 46.22 180 top
R8  200kΩ  [R0603]  28.45 75.31 90 top
R9  30kΩ  [R0603]  30.48 51.69 0 top
R10  50kΩ  [RES-ADJ-TH_3P-L7.1-W6.9-P2.50-L_3362P]  29.72 58.29 0 top
R11  7.5kΩ  [R0603]  30.61 61.85 180 top
R12  20kΩ  [R0603]  31.38 67.55 270 top
R13  10kΩ  [R0603]  33.27 46.48 180 top
R14  30kΩ  [R0603]  48.64 51.94 0 top
R15  10kΩ  [R0603]  51.31 46.74 180 top
R16  20kΩ  [R0603]  50.04 67.56 270 top
R17  200kΩ  [R0603]  47.62 75.31 90 top
R18  50kΩ  [RES-ADJ-TH_3P-L7.1-W6.9-P2.50-L_3362P]  47.62 58.42 0 top
R19  7.5kΩ  [R0603]  49.15 61.85 180 top
R20  30kΩ  [R0603]  66.79 52.5 0 top
R21  10kΩ  [R0603]  69.01 46.97 180 top
R22  20kΩ  [R0603]  68.96 67.69 270 top
R23  200kΩ  [R0603]  65.91 75.31 90 top
R24  50kΩ  [RES-ADJ-TH_3P-L7.1-W6.9-P2.50-L_3362P]  65.79 58.8 0 top
R25  7.5kΩ  [R0603]  68.07 62.1 180 top
R26  200kΩ  [R0603]  84.2 75.56 90 top
R27  30kΩ  [R0603]  85.09 52.83 0 top
R28  50kΩ  [RES-ADJ-TH_3P-L7.1-W6.9-P2.50-L_3362P]  83.82 59.06 0 top
R29  7.5kΩ  [R0603]  86.36 62.48 180 top
R30  20kΩ  [R0603]  87.38 68.07 270 top
R31  10kΩ  [R0603]  87.25 46.86 180 top
R32  200kΩ  [R0603]  80.77 32.13 0 top
R33  30kΩ  [R0603]  58.29 30.86 270 top
R34  50kΩ  [RES-ADJ-TH_3P-L7.1-W6.9-P2.50-L_3362P]  64.26 32.89 270 top
R35  7.5kΩ  [R0603]  67.69 29.72 90 top
R36  20kΩ  [R0603]  73.17 28.95 180 top
R37  10kΩ  [R0603]  52.7 28.58 90 top
R38  200kΩ  [R0603]  81.41 13.46 0 top
R39  30kΩ  [R0603]  57.91 11.56 270 top
R40  50kΩ  [RES-ADJ-TH_3P-L7.1-W6.9-P2.50-L_3362P]  64.26 14.48 270 top
R41  7.5kΩ  [R0603]  67.82 10.92 90 top
R42  20kΩ  [R0603]  73.42 10.28 180 top
R43  10kΩ  [R0603]  53.27 9.63 90 top
R44  200kΩ  [R0603]  36.16 13.49 0 top
R45  30kΩ  [R0603]  13.72 12.57 270 top
R46  50kΩ  [RES-ADJ-TH_3P-L7.1-W6.9-P2.50-L_3362P]  20.19 14.73 270 top
R47  7.5kΩ  [R0603]  23.49 11.56 90 top
R48  20kΩ  [R0603]  29.08 10.79 180 top
R49  10kΩ  [R0603]  8.89 10.54 90 top
SW1  SS-12D06L5  [SW-TH_3P-P4.70_L11.1-W12.7]  89.03 95 180 top
U1  PZ254-2-14-W-2.5-G1  [HDR-TH_28P-P2.54-H-M-R2-C14-S2.54]  4.83 18.54 270 top
U2  STC2450  [SOP-8E]  12.95 73.28 270 top
U3  STC2450  [SOP-8E]  32 73.28 270 top
U4  STC2450  [SOP-8E]  51.05 73.15 270 top
U5  STC2450  [SOP-8E]  69.43 73.2 270 top
U6  STC2450  [SOP-8E]  87.72 73.45 270 top
U7  STC2450  [SOP-8E]  78.58 28.37 180 top
U8  STC2450  [SOP-8E]  78.87 9.78 180 top
U9  STC2450  [SOP-8E]  34.51 10.08 180 top

## Footprints (pads in the part's own frame, mm; a bottom-side part is the same pattern mirrored in y, then rotated)
C0603
  rect 0.8x0.9 smd: 1(-0.7,0) 2(0.7,0)
C1206
  rect 1.485x1.728 smd: 1(-1.593,0) 2(1.593,0)
CAP-SMD_BD6.3-L6.6-W6.6-LS7.6-FD-1
  rect 3.5x1.2 smd: 1(-2.67,0) 2(2.67,0)
CAP-SMD_BD6.3-L6.6-W6.6-LS7.8-FD
  rect 3.5x1.2 smd: 1(-2.67,0) 2(2.67,0)
HDR-TH_28P-P2.54-H-M-R2-C14-S2.54
  rect 1.6x1.6 hole 1.05: 1(-16.51,-1.27)
  round 1.6 hole 1.05: 2(-16.51,1.27) 3(-13.97,-1.27) 4(-13.97,1.27) 5(-11.43,-1.27) 6(-11.43,1.27) 7(-8.89,-1.27) 8(-8.89,1.27) 9(-6.35,-1.27) 10(-6.35,1.27) 11(-3.81,-1.27) 12(-3.81,1.27) 13(-1.27,-1.27) 14(-1.27,1.27) 15(1.27,-1.27) 16(1.27,1.27) 17(3.81,-1.27) 18(3.81,1.27) 19(6.35,-1.27) 20(6.35,1.27) 21(8.89,-1.27) 22(8.89,1.27) 23(11.43,-1.27) 24(11.43,1.27) 25(13.97,-1.27) 26(13.97,1.27) 27(16.51,-1.27) 28(16.51,1.27)
IND-SMD_L7.0-W6.6
  rect 2.4x3.2 smd: 1(-3,0) 2(3,0)
LED0603-RD_1
  rect 0.9x1 smd: 1(-0.85,0) 2(0.85,0)
R0603
  rect 0.806x0.864 smd: 1(-0.753,0) 2(0.753,0)
RES-ADJ-TH_3P-L7.1-W6.9-P2.50-L_3362P
  round 1.8 hole 0.9: 1(-2.54,-1.27) 2(0,1.27) 3(2.54,-1.27)
SMA_L4.3-W2.6-LS5.0-FD
  rect 2.046x1.62 smd: 1(-2.304,-0.009) 2(2.304,0.009)
SOP-8E
  rect 2.5x3.4 smd: 0(0,0)
  rect 1.6x0.65 smd: 1(-2.7,1.905) 2(-2.7,0.635) 3(-2.7,-0.635) 4(-2.7,-1.905) 5(2.7,-1.905) 6(2.7,-0.635) 7(2.7,0.635) 8(2.7,1.905)
SW-TH_3P-P4.70_L11.1-W12.7
  rect 2.5x3 hole 1.8: 1(-4.7,0)
  round 3 hole 1.8: 2(0,0) 3(4.7,0)

## Nets
As in the schematic.

## Via types
v1: diameter 0.61, hole 0.305, Top Layer to Bottom Layer, 200 vias

## Routing (per net, layer and track width the routed paths; a pad name or vN(x,y) marks a point on that pad's centre or on a via; arc(x,y) is an arc through that point)
GND: length 159.6
  Top Layer w0.508: R23.1 67.27,73.2 U5.0 70.07,72.56 U5.7 70.07,64.71 ; 70.39,27.73 68.92,27.73 R35.1 ; 70.39,27.73 U7.7 77.94,27.73 U7.0 78.58,30.69 R32.1 ; 70.39,27.73 69.32,28.81 C43.1 ; 51.69,65.34 50.89,64.55 50.89,64.52 50.66,64.28 50.63,64.28 C22.1 ; 51.69,65.34 U4.7 51.69,72.52 U4.0 49.03,73.15 R17.1 ; 51.69,65.34 51.69,63.64 R19.1 ; C29.1 69.18,63.82 70.07,64.71 ; C8.1 12.44,64.01 13.59,65.15 ; 32.64,64.62 31.73,63.71 C15.1 ; 32.64,64.62 U3.7 32.64,72.64 U3.0 29.73,73.28 R8.1 ; 32.64,64.62 32.64,63.13 R11.1 ; R26.1 85.56,73.45 U6.0 88.36,72.82 U6.7 88.36,65.15 ; 69.53,10.03 70.12,9.44 70.12,9.41 70.28,9.25 70.28,9.14 ; 70.07,64.71 70.07,63.35 R25.1 ; R4.1 10.68,73.28 U2.0 13.59,72.64 U2.7 13.59,65.15 ; R38.1 78.87,11.68 U8.0 78.23,9.14 U8.7 70.28,9.14 ; LED6.1 93.47,46.86 95.25,48.64 ; 70.28,9.14 68.84,9.14 R41.1 ; R47.1 24.85,9.45 26.4,9.45 ; 26.4,9.45 25.21,10.63 C57.1 ; 26.4,9.45 U9.7 33.87,9.45 U9.0 34.51,12.59 R44.1 ; 88.36,65.15 87.87,64.66 87.84,64.66 C36.1 ; 88.36,65.15 88.36,63.73 R29.1 ; 13.59,65.15 13.59,63.64 R6.1
  Top Layer w1.27: C54.1 39.24,4.32 ; 84.2,3.68 84.07,3.81 C47.1 ; C42.1 55.1,22.03 LED7.1
  vias: v1(6.85,79.15) v1(6.86,77.98) v1(7.75,79.15) v1(7.75,77.98) v1(8.75,79.15) v1(8.73,77.98) v1(10.03,43.56) v1(10.03,42.55) v1(11.05,49.28) v1(11.05,48.26) v1(11.36,43.56) v1(11.41,42.55) v1(11.94,73.91) v1(11.94,72.77) v1(12.88,72.77) v1(12.93,73.91) v1(13.89,73.91) v1(13.91,72.77) v1(18.8,78.74) v1(18.8,77.84) v1(21.34,80.64) v1(21.34,79.25) v1(21.34,47.62) v1(22.48,80.64) v1(22.52,79.25) v1(22.73,52.96) v1(22.73,51.97) v1(23.49,60.96) v1(23.49,55.37) v1(23.49,54.1) v1(23.67,80.64) v1(23.71,79.25) v1(23.62,59.56) v1(25.19,60.96) v1(25.21,55.37) v1(25.22,59.56) v1(25.22,54.1) v1(31.02,73.85) v1(31.02,72.71) v1(32.01,73.85) v1(31.96,72.71) v1(32.97,73.85) v1(32.99,72.71) v1(33.94,11.05) v1(33.94,10.09) v1(33.94,9.1) v1(35.08,11.07) v1(35.08,10.03) v1(35.08,9.1) v1(36.58,78.81) v1(36.58,77.91) v1(39.02,17.84) v1(39.02,16.95) v1(39.02,15.75) v1(39.37,47.12) v1(39.97,16.95) v1(39.97,15.75) v1(40.08,80.39) v1(40.08,78.99) v1(40.15,17.84) v1(41.22,80.39) v1(41.26,78.99) v1(41.53,52.45) v1(41.53,51.52) v1(42.16,59.06) v1(42.16,58.17) v1(42.16,55.37) v1(42.16,54.48) v1(42.41,80.39) v1(42.45,78.99) v1(43.29,59.06) v1(43.22,55.37) v1(43.29,54.48) v1(43.37,58.17) v1(50.07,73.72) v1(50.07,72.58) v1(51.01,72.58) v1(51.06,73.72) v1(52.02,73.72) v1(52.04,72.58) v1(55.75,78.94) v1(55.75,78.03) v1(58.27,80.39) v1(58.27,78.99) v1(59.41,80.39) v1(59.46,78.99) v1(60.36,59.63) v1(60.36,58.74) v1(60.36,55.44) v1(60.36,54.55) v1(60.49,20.38) v1(60.49,19.49) v1(60.6,80.39) v1(60.52,78.99) v1(61.49,59.63) v1(61.49,55.44) v1(61.56,58.74) v1(61.56,54.55) v1(61.61,20.38) v1(61.69,19.49) v1(64.56,20.57) v1(64.56,19.68) v1(65.69,20.57) v1(65.76,19.68) v1(68.45,73.77) v1(68.45,72.63) v1(69.38,72.63) v1(69.44,73.77) v1(70.4,73.77) v1(70.42,72.63) v1(74.04,78.68) v1(74.04,77.78) v1(76.86,81.15) v1(76.86,80.14) v1(77.74,81.15) v1(77.79,80.14) v1(78.01,29.33) v1(78.01,28.37) v1(78.01,27.38) v1(78.3,10.75) v1(78.3,9.78) v1(78.3,8.79) v1(78.33,60.05) v1(78.33,59.16) v1(78.33,56) v1(78.33,55.11) v1(78.68,81.15) v1(78.72,80.14) v1(79.15,29.35) v1(79.15,28.32) v1(79.15,27.38) v1(79.46,60.05) v1(79.46,56) v1(79.44,10.76) v1(79.44,9.73) v1(79.44,8.79) v1(79.53,59.16) v1(79.53,55.11) v1(84.69,21.93) v1(84.69,21.04) v1(84.71,19.98) v1(85.82,21.93) v1(85.89,21.04) v1(85.87,19.98) v1(86.73,74.03) v1(86.73,72.88) v1(87.67,72.88) v1(87.73,74.03) v1(87.88,37.16) v1(87.88,36.25) v1(87.94,38.23) v1(88.69,74.03) v1(88.71,72.88) v1(88.84,38.23) v1(89.03,37.16) v1(89.03,36.25) v1(92.33,78.81) v1(92.33,77.91) v1(93.53,79.25) v1(94.43,79.25) v1(95.05,56.01) v1(95.05,54.99) v1(95.25,80.59) v1(95.25,79.69) v1(95.7,60.09) v1(95.7,59.18) v1(95.76,52.9) v1(95.83,56.01) v1(95.83,54.99) v1(95.89,51.49)
VCCSREER1: length 21.7
  Top Layer w0.254: D2.2 13.33,49.28 R1.2
  Top Layer w1.27: U1.2 9.4,35.05 13.32,38.97 D2.2
VCCSREER2: length 38.2
  Top Layer w0.254: D4.2 32.11,50.81 R9.2
  Top Layer w1.27: D4.2 32.13,49.25 32.13,45.08 19.56,32.51 U1.4
VCCSREER3: length 57.3
  Top Layer w0.254: R14.2 49.77,51.57 D6.2
  Top Layer w1.27: D6.2 50.04,49.25 50.04,45.21 34.8,29.97 U1.6
VCCSREER4: length 76.3
  Top Layer w0.254: 67.93,49.65 67.93,52.11 67.54,52.5
  Top Layer w1.27: 67.93,49.65 67.93,45.83 65.15,43.05 52.58,43.05 36.96,27.43 U1.8
VCCSREER5: length 96.5
  Top Layer w0.508: 86.21,50.03 86.21,52.46 R27.2
  Top Layer w1.27: U1.10 39.12,24.89 53.97,39.75 81.66,39.75 86.21,44.31 D10.2
VCCSREER6: length 56.7
  Top Layer w0.508: 58.29,30.5 58.8,29.99 D12.2
  Top Layer w1.27: D12.2 55.25,30.1 50.04,30.1 42.29,22.35 U1.12
VCCSREER7: length 58
  Top Layer w0.508: R39.2 57.79,10.69 D14.2 55.19,10.38 R43.2
  Top Layer w1.27: U1.14 46.36,19.81 D14.2
VCCSREER8: length 13.6
  Top Layer w0.508: R45.2 12.96,11.07 D16.2 11.07,11.29 R49.2
  Top Layer w1.27: D16.2 11.29,12.07 U1.16
VIN:
  vias: v1(47.75,12.06) v1(47.81,13.97) v1(49.12,13.84) v1(49.11,12.01) v1(50.42,12.19) v1(50.42,11.05) v1(93.02,26.54) v1(93.02,25.4) v1(93.02,12.95) v1(93.02,11.94) v1(93.02,11.05) v1(93.15,31.88) v1(93.15,30.86) v1(93.92,26.54) v1(93.92,25.4) v1(93.92,12.95) v1(93.92,11.94) v1(93.92,11.05) v1(94.05,31.88) v1(94.05,30.86) v1(96.01,9.72) v1(96.01,8.82)
EN: length 302.1
  Top Layer w0.254: v1(66.87,78.23) 68.8,76.3 U5.3 ; U9.3 38.02,10.72 39.88,12.57 v1(39.88,12.7) ; U6.3 87.09,76.4 85.13,78.36 v1(85.09,78.36) ; U2.3 12.32,77.22 v1(11.68,77.85) ; v1(48.77,77.98) 50.42,76.33 U4.3 ; U8.3 82.3,10.41 84.71,12.83 v1(84.71,12.95) ; U7.3 81.96,29 84.33,31.37 v1(84.33,32.39) ; 31.37,75.98 31.37,76.96 v1(30.48,77.85)
  Inner2 w0.254: 85.85,14.1 94.49,14.1 96.52,16.13 96.52,42.04 ; 85.85,14.1 85.85,14.22 81.53,18.54 45.72,18.54 v1(39.88,12.7) ; 85.85,14.1 v1(84.71,12.95) ; 89.03,88.39 96.52,80.9 96.52,42.04 ; 89.03,88.39 SW1.2 ; 89.03,88.39 85.6,84.96 83.96,84.96 ; v1(66.87,78.23) 65.67,79.43 65.67,84.96 ; v1(30.48,77.85) 29.11,79.22 29.11,84.96 ; 47.44,84.96 47.44,79.31 v1(48.77,77.98) ; 47.44,84.96 29.11,84.96 ; 47.44,84.96 65.67,84.96 ; 83.96,84.96 83.96,79.48 v1(85.09,78.36) ; 83.96,84.96 65.67,84.96 ; 96.52,42.04 86.87,32.39 v1(84.33,32.39) ; 29.11,84.96 13.59,84.96 11.68,83.06 v1(11.68,77.85)
$1N896: length 14.9
  Top Layer w0.254: R5.3 13.84,59.06 10.68,62.22 R6.2 10.68,70.21 U2.5
$1N897: length 10.2
  Top Layer w0.254: R1.1 8.76,54.87 R5.1 R5.2
$1N898: length 2
  Top Layer w0.508: R2.1 LED1.2
$1N901: length 1.9
  Top Layer w0.254: R3.1 U2.6
$1N904: length 1.8
  Top Layer w0.254: R3.2 12.19,67.07 C8.2
$1N910: length 1.7
  Top Layer w0.508: U2.4 10.96,76.06 R4.2
$1N912: length 2.9
  Top Layer w0.508: U2.1 15.14,75.98 C1.2
$1N2242: length 1.7
  Top Layer w0.254: LED2.2 8.95,47.86 R7.1
$1N3603: length 1.7
  Top Layer w0.254: C15.2 31.41,66.77 R12.2
$1N3605: length 14.7
  Top Layer w0.254: R10.3 32.26,59.44 R11.2 29.85,70.33 U3.5
$1N3611: length 2.3
  Top Layer w0.254: R12.1 31.38,70.57 31.37,70.58
$1N3612: length 10
  Top Layer w0.254: R10.2 R10.1 27.18,54.24 R9.1
$1N3613: length 2.2
  Top Layer w0.508: R13.1 LED3.2
$1N3618: length 2.7
  Top Layer w0.508: C13.2 35.69,74.2 U3.1
$1N3619: length 1.7
  Top Layer w0.508: U3.4 30.01,76.06 R8.2
$2N826: length 1.6
  Top Layer w0.508: R17.2 48.94,76.06 U4.4
$2N830: length 2.7
  Top Layer w0.508: C16.2 54.74,74.07 U4.1
$2N834: length 14.3
  Top Layer w0.254: U4.5 48.4,69.7 R19.2 48.4,61.21 50.17,59.44 R18.3
$2N835: length 10
  Top Layer w0.254: R18.2 R18.1 47.89,54.35 R14.1
$2N836: length 2
  Top Layer w0.508: R15.1 LED4.2
$2N838: length 2.3
  Top Layer w0.254: U4.6 50.42,68.7 R16.1
$2N840: length 1.7
  Top Layer w0.254: R16.2 C22.2
$2N1616: length 1.7
  Top Layer w0.508: R23.2 67.36,76.06 U5.4
$2N1620: length 2.7
  Top Layer w0.508: C23.2 73.02,74.21 U5.1
$2N1624: length 13.5
  Top Layer w0.254: R24.3 68.33,59.94 67.31,60.96 67.31,62.09 R25.2 67.32,70.29 U5.5
$2N1625: length 9.8
  Top Layer w0.254: R24.2 R24.1 66.04,54.74 R20.1
$2N1626: length 2.4
  Top Layer w0.508: R21.1 72.15,46.97 LED5.2
$2N1628: length 2.1
  Top Layer w0.254: R22.1 68.96,70.34 U5.6
$2N1630: length 1.7
  Top Layer w0.254: R22.2 C29.2
$3N826: length 9.9
  Top Layer w0.508: R27.1 81.03,56.14 81.03,57.78 83.57,60.33
$3N827: length 13.4
  Top Layer w0.254: R29.2 85.47,62.35 85.47,61.21
  Top Layer w0.508: 85.47,61.21 86.11,60.58 86.11,57.78 ; U6.5 85.61,70.55 R29.2
$3N828: length 2.3
  Top Layer w0.254: 90.07,46.86 LED6.2
  Top Layer w0.508: R31.1 90.07,46.86
$3N829: length 1.9
  Top Layer w0.508: R30.2 87.38,65.6 C36.2
$3N833: length 1.7
  Top Layer w0.508: R26.2 85.65,76.32 U6.4
$3N842: length 2
  Top Layer w0.508: R30.1 87.38,70.46 U6.6
$3N844: length 3.3
  Top Layer w0.508: 91.6,74.07 91.6,74.58 91.69,74.68 90.22,76.15 U6.1
$3N1616: length 9.9
  Top Layer w0.508: R33.1 59.17,31.61 R34.1 R34.2
$3N1617: length 13
  Top Layer w0.508: U7.5 75.68,30.47 R35.2 67.57,30.35 R34.3
$3N1618: length 1.7
  Top Layer w0.508: R37.1 52.7,26.12
$3N1619: length 1.7
  Top Layer w0.508: C43.2 70.75,28.95 R36.2
$3N1623: length 2
  Top Layer w0.508: U7.4 81.53,30.52 R32.2
$3N1632: length 2
  Top Layer w0.508: U7.6 75.82,28.95 R36.1
$3N1634: length 2.7
  Top Layer w0.508: C41.2 81.28,25.97 U7.1
$4N826: length 13.3
  Top Layer w0.508: R40.3 67.56,11.94 R41.2 76.16,11.68 U8.5
$4N827: length 1.7
  Top Layer w0.508: 70.93,10.29 72.66,10.29 R42.2
$4N829: length 1.7
  Top Layer w0.508: R43.1 LED8.2
$4N831: length 10.6
  Top Layer w0.508: R39.1 62.62,17.02 R40.1 R40.2
$4N834: length 2
  Top Layer w0.508: U8.4 82.16,12.28 R38.2
$4N840: length 2.7
  Top Layer w0.508: U8.1 81.57,7.78 C48.2
$4N842: length 2.1
  Top Layer w0.508: R42.1 76.03,10.28 U8.6
$4N2395: length 1.6
  Top Layer w0.508: R44.2 37.21,13.19 U9.4
$4N2397: length 10.4
  Top Layer w0.508: R45.1 14.98,13.33 R46.1 R46.2
$4N2400: length 1.7
  Top Layer w0.508: C57.2 R48.2
$4N2401: length 13.1
  Top Layer w0.508: U9.5 23.82,11.99 R47.2 23.38,12.19 R46.3
$4N2402: length 1.7
  Top Layer w0.508: R49.1 LED9.2
$4N2410: length 2.4
  Top Layer w0.508: C55.2 35.51,6.48 U9.1
$4N2413: length 2
  Top Layer w0.508: R48.1 31.73,10.79 U9.6

## Copper pours and planes (outline as drawn; the poured copper is in the pictures)
GND on Top Layer: 37.72,18.54 42.8,18.54 42.8,14.86 37.72,14.86
GND on Top Layer: 37.46,77.6 46.48,77.6 46.48,45.97 37.46,45.97
GND on Top Layer: 34.42,81.79 46.53,81.79 46.53,77.6 34.42,77.6
GND on Top Layer: 72.44,32.79 80.52,32.79 80.52,20.07 72.44,20.07
GND on Top Layer: 7.37,50.17 11.82,50.17 11.82,40.39 7.37,40.39
GND on Top Layer: 90.8,80.26 93.04,80.26 93.04,76 90.8,76
GND on Top Layer: 83.21,26.62 87.38,26.62 87.38,15.11 83.21,15.11
GND on Top Layer: 26.8,74.93 39.62,74.93 39.62,67.06 26.8,67.06
GND on Top Layer: 0.43,8.13 97.54,8.13 97.54,0.38 0.43,0.38
GND on Top Layer: 44.81,74.89 58.42,74.89 58.42,67.06 44.81,67.06
GND on Top Layer: 20.32,77.6 28.17,77.6 28.17,51.18 20.32,51.18
GND on Top Layer: 28.83,14.1 36.07,14.1 36.07,0.38 28.83,0.38
GND on Top Layer: 55.24,77.6 64.53,77.6 64.53,46.23 55.24,46.23
GND on Top Layer: 73.41,77.72 82.93,77.72 82.93,46.48 73.41,46.48
GND on Top Layer: 57.15,22.73 83.24,22.73 83.24,14.99 57.15,14.99
GND on Top Layer: 92.84,81.87 97.22,81.87 97.22,51.56 92.84,51.56
GND on Top Layer: 73.15,14.1 81.15,14.1 81.15,1.14 73.15,1.14
GND on Top Layer: 18.8,51.44 26.03,51.44 26.03,46.23 18.8,46.23
GND on Top Layer: 72.01,81.66 82.93,81.66 82.93,77.47 72.01,77.47
GND on Top Layer: 85.6,53.54 97.06,53.54 97.06,33.75 85.6,33.75
GND on Top Layer: 15.89,81.74 28.26,81.74 28.26,77.39 15.89,77.39
GND on Top Layer: 80.64,74.68 95.89,74.68 95.89,67.69 80.64,67.69
GND on Top Layer: 62.86,75.06 77.34,75.06 77.34,67.06 62.86,67.06
GND on Top Layer: 5.97,81.15 9.52,81.15 9.52,77.14 5.97,77.14
GND on Top Layer: 53.97,81.79 64.53,81.79 64.53,77.6 53.97,77.6
GND on Top Layer: 5.81,81.3 20.95,81.3 20.95,66.67 5.81,66.67
GND on Bottom Layer: 2.36,15.89 7.62,15.89 7.62,0.76 2.36,0.76
GND on Bottom Layer: 0.76,97.28 97.15,97.28 97.15,0.51 0.76,0.51
VIN on Top Layer: 46.36,14.35 51.87,14.35 51.87,5.97 46.36,5.97
VIN on Top Layer: 91.57,34.92 96.65,34.92 96.65,6.81 91.57,6.81
VIN on Top Layer: 0.76,97.28 89.79,97.28 89.79,16.3 0.76,16.3
VIN on Inner1: 0.89,97.28 97.66,97.28 97.66,1 0.89,1
VIN on Inner2: 0.89,97.16 97.66,97.16 97.66,0.38 0.89,0.38
$1N902 on Top Layer: 15.11,63.37 18.98,63.37 18.98,48.51 15.11,48.51
$1N905 on Top Layer: 11.3,84.84 17.11,84.84 17.11,75.18 11.3,75.18
$1N911 on Top Layer: 14.48,73.13 18.8,73.13 18.8,66.93 14.48,66.93
$1N3604 on Top Layer: 33.56,73 37.72,73 37.72,66.93 33.56,66.93
$1N3610 on Top Layer: 33.88,63.44 37.75,63.44 37.75,48.58 33.88,48.58
$1N3615 on Top Layer: 29.84,84.96 35.94,84.96 35.94,75.11 29.84,75.11
$2N827 on Top Layer: 48.26,85.09 54.48,85.09 54.48,75.05 48.26,75.05
$2N832 on Top Layer: 51.94,63.5 56.26,63.5 56.26,48.69 51.94,48.69
$2N841 on Top Layer: 52.7,72.9 56.35,72.9 56.35,67.06 52.7,67.06
$2N1617 on Top Layer: 66.29,85.22 72.9,85.22 72.9,75.11 66.29,75.11
$2N1622 on Top Layer: 69.85,63.5 75.18,63.5 75.18,48.82 69.85,48.82
$2N1631 on Top Layer: 70.99,72.87 75.18,72.87 75.18,67.06 70.99,67.06
$3N838 on Top Layer: 84.58,85.22 91.15,85.22 91.15,75.31 84.58,75.31
$3N840 on Top Layer: 88.01,64.14 93.6,64.14 93.6,48.77 88.01,48.77
$3N841 on Top Layer: 89.28,73.23 93.58,73.23 93.58,67.69 89.28,67.69
$3N1628 on Top Layer: 80.46,31.88 90.68,31.88 90.68,26.03 80.46,26.03
$3N1630 on Top Layer: 54.61,27.94 69.34,27.94 69.34,22.73 54.61,22.73
$3N1631 on Top Layer: 72.77,26.84 78.74,26.84 78.74,22.73 72.77,22.73
$4N833 on Top Layer: 54.61,9.91 69.74,9.91 69.74,3.94 54.61,3.94
$4N838 on Top Layer: 80.78,13.34 90.55,13.34 90.55,6.73 80.78,6.73
$4N839 on Top Layer: 73.28,8.25 78.75,8.25 78.75,3.94 73.28,3.94
$4N2399 on Top Layer: 10.41,10.03 25.27,10.03 25.27,3.81 10.41,3.81
$4N2405 on Top Layer: 28.83,8.51 34.5,8.51 34.5,3.94 28.83,3.94
$4N2408 on Top Layer: 36.36,13.72 45.08,13.72 45.08,7.11 36.36,7.11

## Text on the board
Top Silkscreen Layer: 2025 | 工业装配
